# Altium project APE - Single Board Computer.PrjPcb (part 2 of 3)

## Sheet 07_Storage.SchDoc
size 812 x 508 mm; SheetNumber: 7; SheetTotal: 16
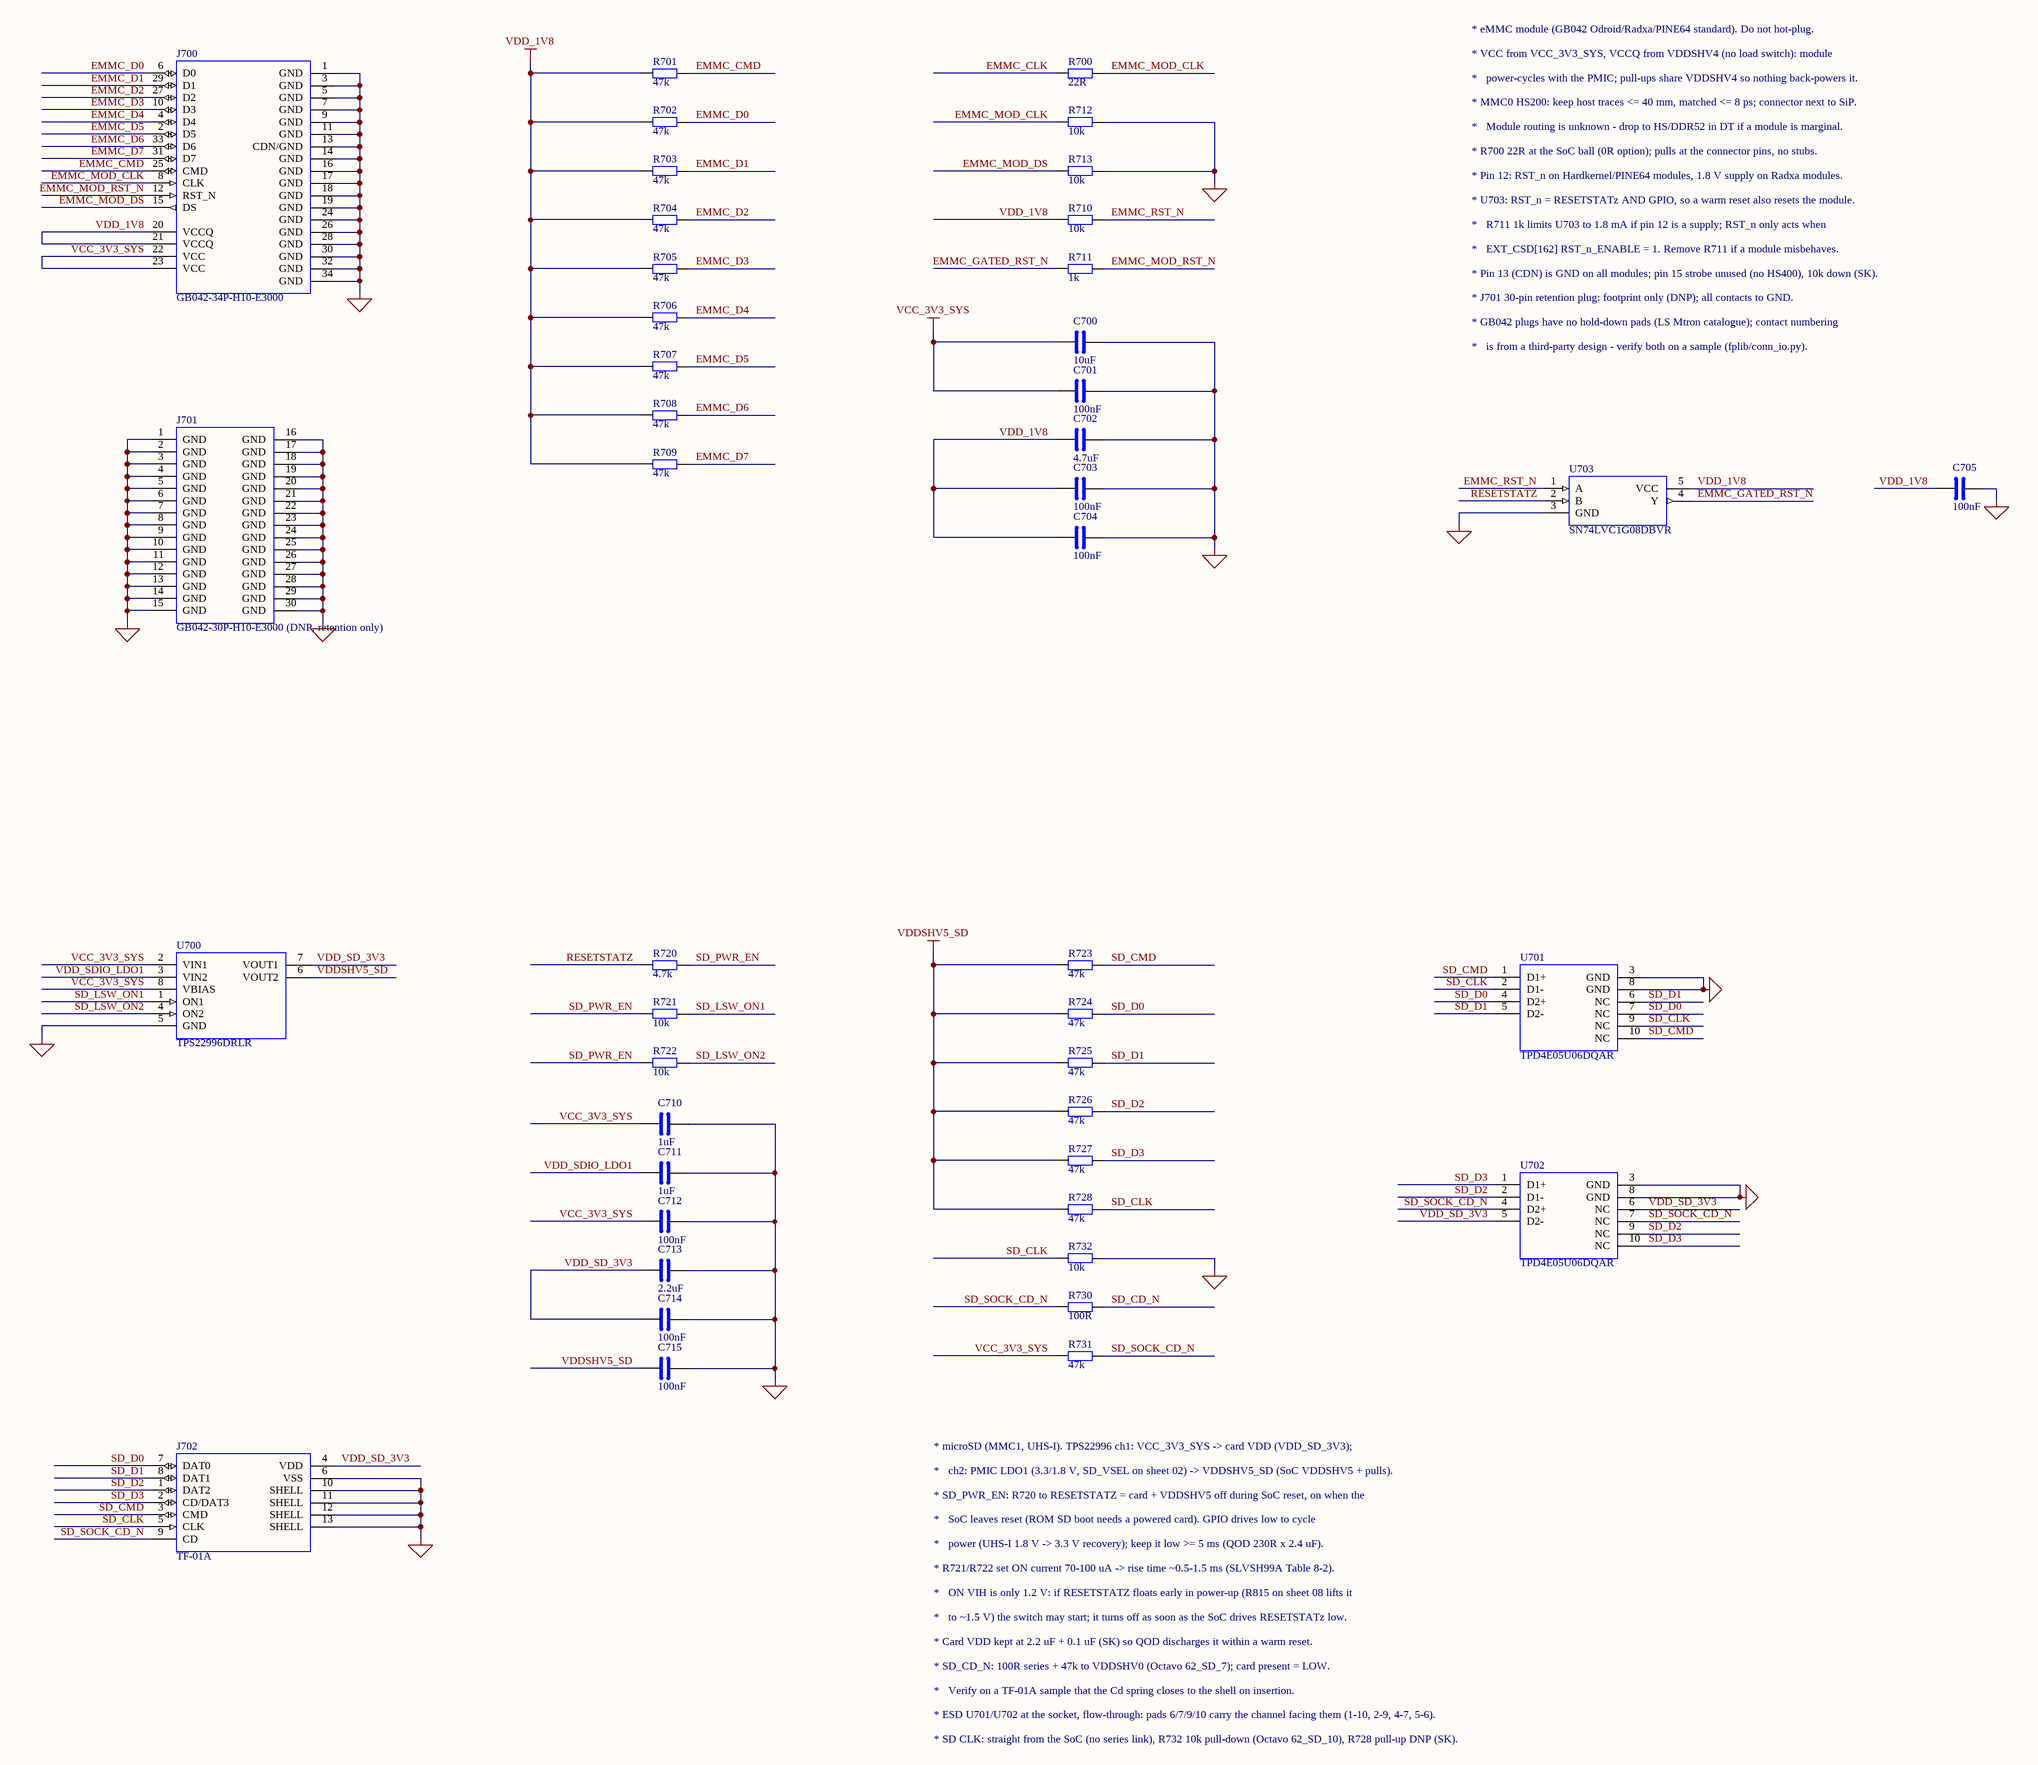
[diagram p9: 07_Storage.SchDoc]

### Parts
C700  10uF  [C0603]
C701  100nF  [C0402]
C702  4.7uF  [C0603]
C703  100nF  [C0402]
C704  100nF  [C0402]
C705  100nF  [C0402]
C710  1uF  [C0402]
C711  1uF  [C0402]
C712  100nF  [C0402]
C713  2.2uF  [C0402]
C714  100nF  [C0402]
C715  100nF  [C0402]
J700  GB042-34P-H10-E3000  [B2B_LSM_GB042-34P-H10]
J701  GB042-30P-H10-E3000 (DNP, retention only)  [B2B_LSM_GB042-30P-H10]
J702  TF-01A  [MICROSD_HRO_TF-01A]
R700  22R  [R0402]
R701  47k  [R0402]
R702  47k  [R0402]
R703  47k  [R0402]
R704  47k  [R0402]
R705  47k  [R0402]
R706  47k  [R0402]
R707  47k  [R0402]
R708  47k  [R0402]
R709  47k  [R0402]
R710  10k  [R0402]
R711  1k  [R0402]
R712  10k  [R0402]
R713  10k  [R0402]
R720  4.7k  [R0402]
R721  10k  [R0402]
R722  10k  [R0402]
R723  47k  [R0402]
R724  47k  [R0402]
R725  47k  [R0402]
R726  47k  [R0402]
R727  47k  [R0402]
R728  47k  [R0402]
R730  100R  [R0402]
R731  47k  [R0402]
R732  10k  [R0402]
U700  TPS22996DRLR  [SOT583-8]
U701  TPD4E05U06DQAR  [USON10_DQA]
U702  TPD4E05U06DQAR  [USON10_DQA]
U703  SN74LVC1G08DBVR  [SOT23-5]

### Nets
GND: C700.2 C701.2 C702.2 C703.2 C704.2 C705.2 C710.2 C711.2 C712.2 C713.2 C714.2 C715.2 J700.1(GND) J700.3(GND) J700.5(GND) J700.7(GND) J700.9(GND) J700.11(GND) J700.13(CDN/GND) J700.14(GND) J700.16(GND) J700.17(GND) J700.18(GND) J700.19(GND) J700.24(GND) J700.26(GND) J700.28(GND) J700.30(GND) J700.32(GND) J700.34(GND) J701.1(GND) J701.2(GND) J701.3(GND) J701.4(GND) J701.5(GND) J701.6(GND) J701.7(GND) J701.8(GND) J701.9(GND) J701.10(GND) J701.11(GND) J701.12(GND) J701.13(GND) J701.14(GND) J701.15(GND) J701.16(GND) J701.17(GND) J701.18(GND) J701.19(GND) J701.20(GND) J701.21(GND) J701.22(GND) J701.23(GND) J701.24(GND) J701.25(GND) J701.26(GND) J701.27(GND) J701.28(GND) J701.29(GND) J701.30(GND) J702.6(VSS) J702.10(SHELL) J702.11(SHELL) J702.12(SHELL) J702.13(SHELL) R712.2 R713.2 R732.2 U700.5(GND) U701.3(GND) U701.8(GND) U702.3(GND) U702.8(GND) U703.3(GND)
VCC_3V3_SYS: C700.1 C701.1 C710.1 C712.1 J700.22(VCC) J700.23(VCC) R731.1 U700.2(VIN1) U700.8(VBIAS)
VDD_1V8: C702.1 C703.1 C704.1 C705.1 J700.20(VCCQ) J700.21(VCCQ) R701.1 R702.1 R703.1 R704.1 R705.1 R706.1 R707.1 R708.1 R709.1 R710.1 U703.5(VCC)
VDDSHV5_SD: C715.1 R723.1 R724.1 R725.1 R726.1 R727.1 R728.1 U700.6(VOUT2)
EMMC_CLK: R700.1
EMMC_CMD: J700.25(CMD) R701.2
EMMC_D0: J700.6(D0) R702.2
EMMC_D1: J700.29(D1) R703.2
EMMC_D2: J700.27(D2) R704.2
EMMC_D3: J700.10(D3) R705.2
EMMC_D4: J700.4(D4) R706.2
EMMC_D5: J700.2(D5) R707.2
EMMC_D6: J700.33(D6) R708.2
EMMC_D7: J700.31(D7) R709.2
EMMC_GATED_RST_N: R711.1 U703.4(Y)
EMMC_MOD_CLK: J700.8(CLK) R700.2 R712.1
EMMC_MOD_DS: J700.15(DS) R713.1
EMMC_MOD_RST_N: J700.12(RST_N) R711.2
EMMC_RST_N: R710.2 U703.1(A)
RESETSTATZ: R720.1 U703.2(B)
SD_CD_N: R730.2
SD_CLK: J702.5(CLK) R728.2 R732.1 U701.2(D1-) U701.9(NC)
SD_CMD: J702.3(CMD) R723.2 U701.1(D1+) U701.10(NC)
SD_D0: J702.7(DAT0) R724.2 U701.4(D2+) U701.7(NC)
SD_D1: J702.8(DAT1) R725.2 U701.5(D2-) U701.6(NC)
SD_D2: J702.1(DAT2) R726.2 U702.2(D1-) U702.9(NC)
SD_D3: J702.2(CD/DAT3) R727.2 U702.1(D1+) U702.10(NC)
SD_LSW_ON1: R721.2 U700.1(ON1)
SD_LSW_ON2: R722.2 U700.4(ON2)
SD_PWR_EN: R720.2 R721.1 R722.1
SD_SOCK_CD_N: J702.9(CD) R730.1 R731.2 U702.4(D2+) U702.7(NC)
VDD_SD_3V3: C713.1 C714.1 J702.4(VDD) U700.7(VOUT1) U702.5(D2-) U702.6(NC)
VDD_SDIO_LDO1: C711.1 U700.3(VIN2)

### Notes on the sheet
- * eMMC module (GB042 Odroid/Radxa/PINE64 standard). Do not hot-plug.
- * VCC from VCC_3V3_SYS, VCCQ from VDDSHV4 (no load switch): module
- *   power-cycles with the PMIC; pull-ups share VDDSHV4 so nothing back-powers it.
- * MMC0 HS200: keep host traces <= 40 mm, matched <= 8 ps; connector next to SiP.
- *   Module routing is unknown - drop to HS/DDR52 in DT if a module is marginal.
- * R700 22R at the SoC ball (0R option); pulls at the connector pins, no stubs.
- * Pin 12: RST_n on Hardkernel/PINE64 modules, 1.8 V supply on Radxa modules.
- * U703: RST_n = RESETSTATz AND GPIO, so a warm reset also resets the module.
- *   R711 1k limits U703 to 1.8 mA if pin 12 is a supply; RST_n only acts when
- *   EXT_CSD[162] RST_n_ENABLE = 1. Remove R711 if a module misbehaves.
- * Pin 13 (CDN) is GND on all modules; pin 15 strobe unused (no HS400), 10k down (SK).
- * J701 30-pin retention plug: footprint only (DNP); all contacts to GND.
- * GB042 plugs have no hold-down pads (LS Mtron catalogue); contact numbering
- *   is from a third-party design - verify both on a sample (fplib/conn_io.py).
- * microSD (MMC1, UHS-I). TPS22996 ch1: VCC_3V3_SYS -> card VDD (VDD_SD_3V3);
- *   ch2: PMIC LDO1 (3.3/1.8 V, SD_VSEL on sheet 02) -> VDDSHV5_SD (SoC VDDSHV5 + pulls).
- * SD_PWR_EN: R720 to RESETSTATZ = card + VDDSHV5 off during SoC reset, on when the
- *   SoC leaves reset (ROM SD boot needs a powered card). GPIO drives low to cycle
- *   power (UHS-I 1.8 V -> 3.3 V recovery); keep it low >= 5 ms (QOD 230R x 2.4 uF).
- * R721/R722 set ON current 70-100 uA -> rise time ~0.5-1.5 ms (SLVSH99A Table 8-2).
- *   ON VIH is only 1.2 V: if RESETSTATZ floats early in power-up (R815 on sheet 08 lifts it
- *   to ~1.5 V) the switch may start; it turns off as soon as the SoC drives RESETSTATz low.
- * Card VDD kept at 2.2 uF + 0.1 uF (SK) so QOD discharges it within a warm reset.
- * SD_CD_N: 100R series + 47k to VDDSHV0 (Octavo 62_SD_7); card present = LOW.
- *   Verify on a TF-01A sample that the Cd spring closes to the shell on insertion.
- * ESD U701/U702 at the socket, flow-through: pads 6/7/9/10 carry the channel facing them (1-10, 2-9, 4-7, 5-6).
- * SD CLK: straight from the SoC (no series link), R732 10k pull-down (Octavo 62_SD_10), R728 pull-up DNP (SK).

### Library data of the parts
C700 = CAP: Capacitor, non-polarized; Spec: 10uF 10V X5R 0603 (VCC)
C701 = CAP: Capacitor, non-polarized; Spec: 100nF 16V X7R 0402 (VCC)
C702 = CAP: Capacitor, non-polarized; Spec: 4.7uF 10V X5R 0603 (VCCQ)
C703 = CAP: Capacitor, non-polarized; Spec: 100nF 16V X7R 0402 (VCCQ pin 20)
C704 = CAP: Capacitor, non-polarized; Spec: 100nF 16V X7R 0402 (VCCQ pin 21)
C705 = CAP: Capacitor, non-polarized; Spec: 100nF 16V X7R 0402 (U703 VCC)
C710 = CAP: Capacitor, non-polarized; Spec: 1uF 25V X5R 0402 (VIN1)
C711 = CAP: Capacitor, non-polarized; Spec: 1uF 25V X5R 0402 (VIN2)
C712 = CAP: Capacitor, non-polarized; Spec: 100nF 16V X7R 0402 (VBIAS)
C713 = CAP: Capacitor, non-polarized; Spec: 2.2uF 10V X5R 0402 (card VDD)
C714 = CAP: Capacitor, non-polarized; Spec: 100nF 16V X7R 0402 (card VDD)
C715 = CAP: Capacitor, non-polarized; Spec: 100nF 16V X7R 0402 (VOUT2)
J700 = GB042-34P-H10: eMMC-module connector, LS Mtron GB042 34-pin 0.4 mm B2B plug (Odroid/Radxa/PINE64 pinout); MPN: GB042-34P-H10-E3000; Manufacturer: LS Mtron; Supplier: broker, consigned to JLC (STOCK RISK)
J701 = GB042-30P-H10: eMMC-module retention connector, LS Mtron GB042 30-pin 0.4 mm B2B plug (mechanical, all GND); DNP: 1; MPN: GB042-30P-H10-E3000; Manufacturer: LS Mtron
J702 = TF-01A: microSD push-push socket with card-detect switch (Hroparts TF-01A); Manufacturer: Korean Hroparts Elec; MPN: TF-01A; LCSC: C91145
R700 = RES: Resistor; Spec: 22R 0402 (at SoC; 0R option)
R701-R709 R723-R727 = RES: Resistor; Spec: 47k 0402
R710 = RES: Resistor; Spec: 10k 0402 (GPIO pull-up: reset follows RESETSTATz by default)
R711 = RES: Resistor; Spec: 1k 0402 (RST_n link, see note)
R712 = RES: Resistor; Spec: 10k 0402 (CLK pull-down, at pin 8)
R713 = RES: Resistor; Spec: 10k 0402 (strobe pull-down)
R720 = RES: Resistor; Spec: 4.7k 0402 (SD power follows RESETSTATz)
R721 = RES: Resistor; Spec: 10k 0402 (RT1 rise time)
R722 = RES: Resistor; Spec: 10k 0402 (RT2 rise time)
R728 = RES: Resistor; DNP: 1; Spec: 47k 0402 (DNP)
R730 = RES: Resistor; Spec: 100R 0402 (SDCD series)
R731 = RES: Resistor; Spec: 47k 0402 (SDCD pull-up)
R732 = RES: Resistor; Spec: 10k 0402 (CLK pull-down, Octavo 62_SD_10)
U700 = TPS22996_DRL: TPS22996 dual 4 A load switch with QOD and ON-current set rise time, SOT-583-8; Manufacturer: Texas Instruments; MPN: TPS22996DRLR
U701 U702 = TPD4E05U06_DQA: 4-channel 0.5 pF ESD array, USON-10; Manufacturer: Texas Instruments; MPN: TPD4E05U06DQAR
U703 = SN74LVC1G08_DBV: Single 2-input AND gate, SOT-23-5; Manufacturer: Texas Instruments; MPN: SN74LVC1G08DBVR; LCSC: C7666

## Sheet 08_Ethernet.SchDoc
size 812 x 508 mm; SheetNumber: 8; SheetTotal: 16
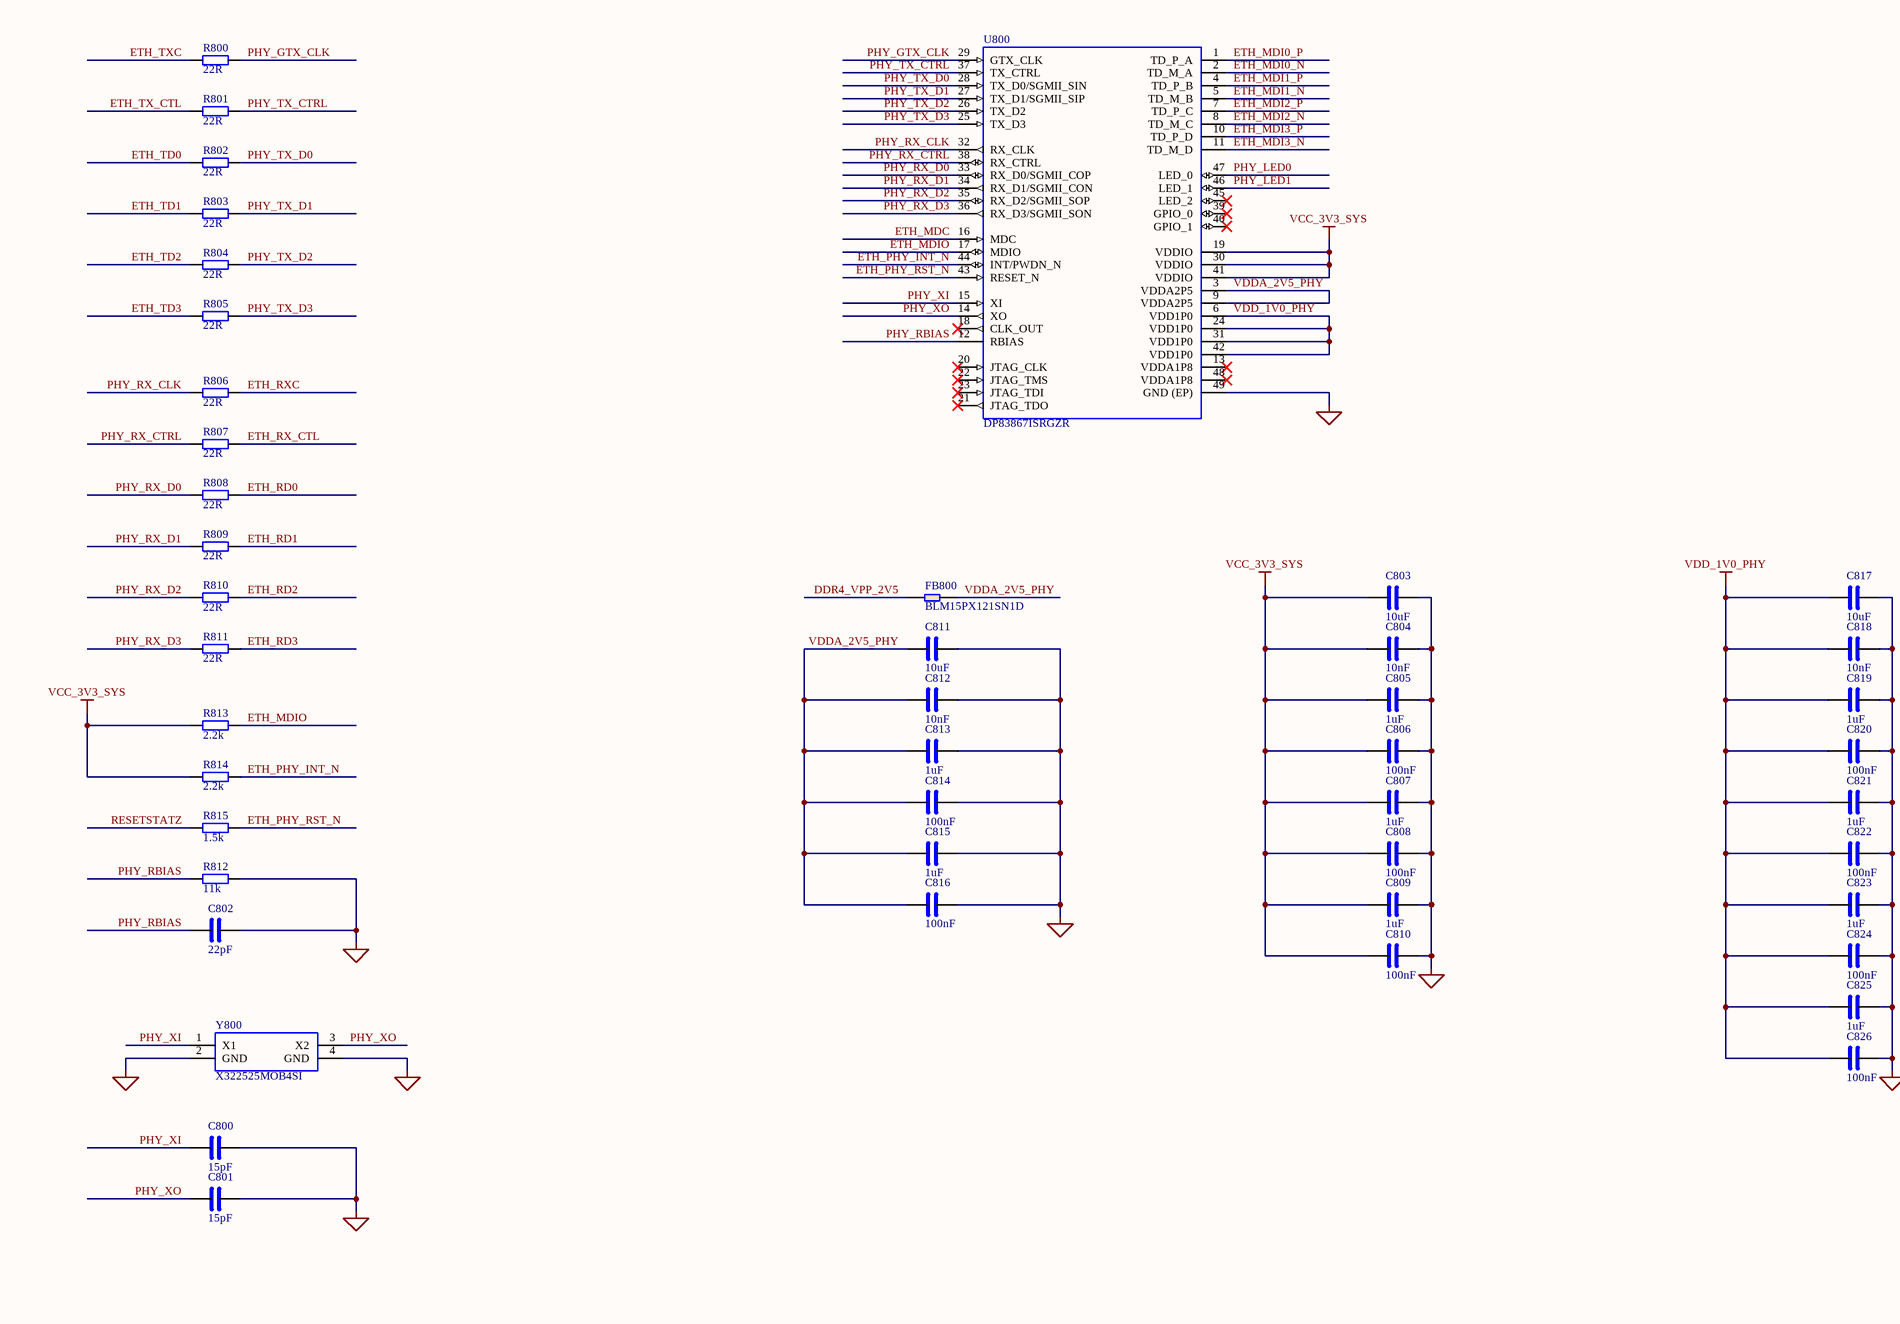
[diagram p10: 08_Ethernet.SchDoc, left]
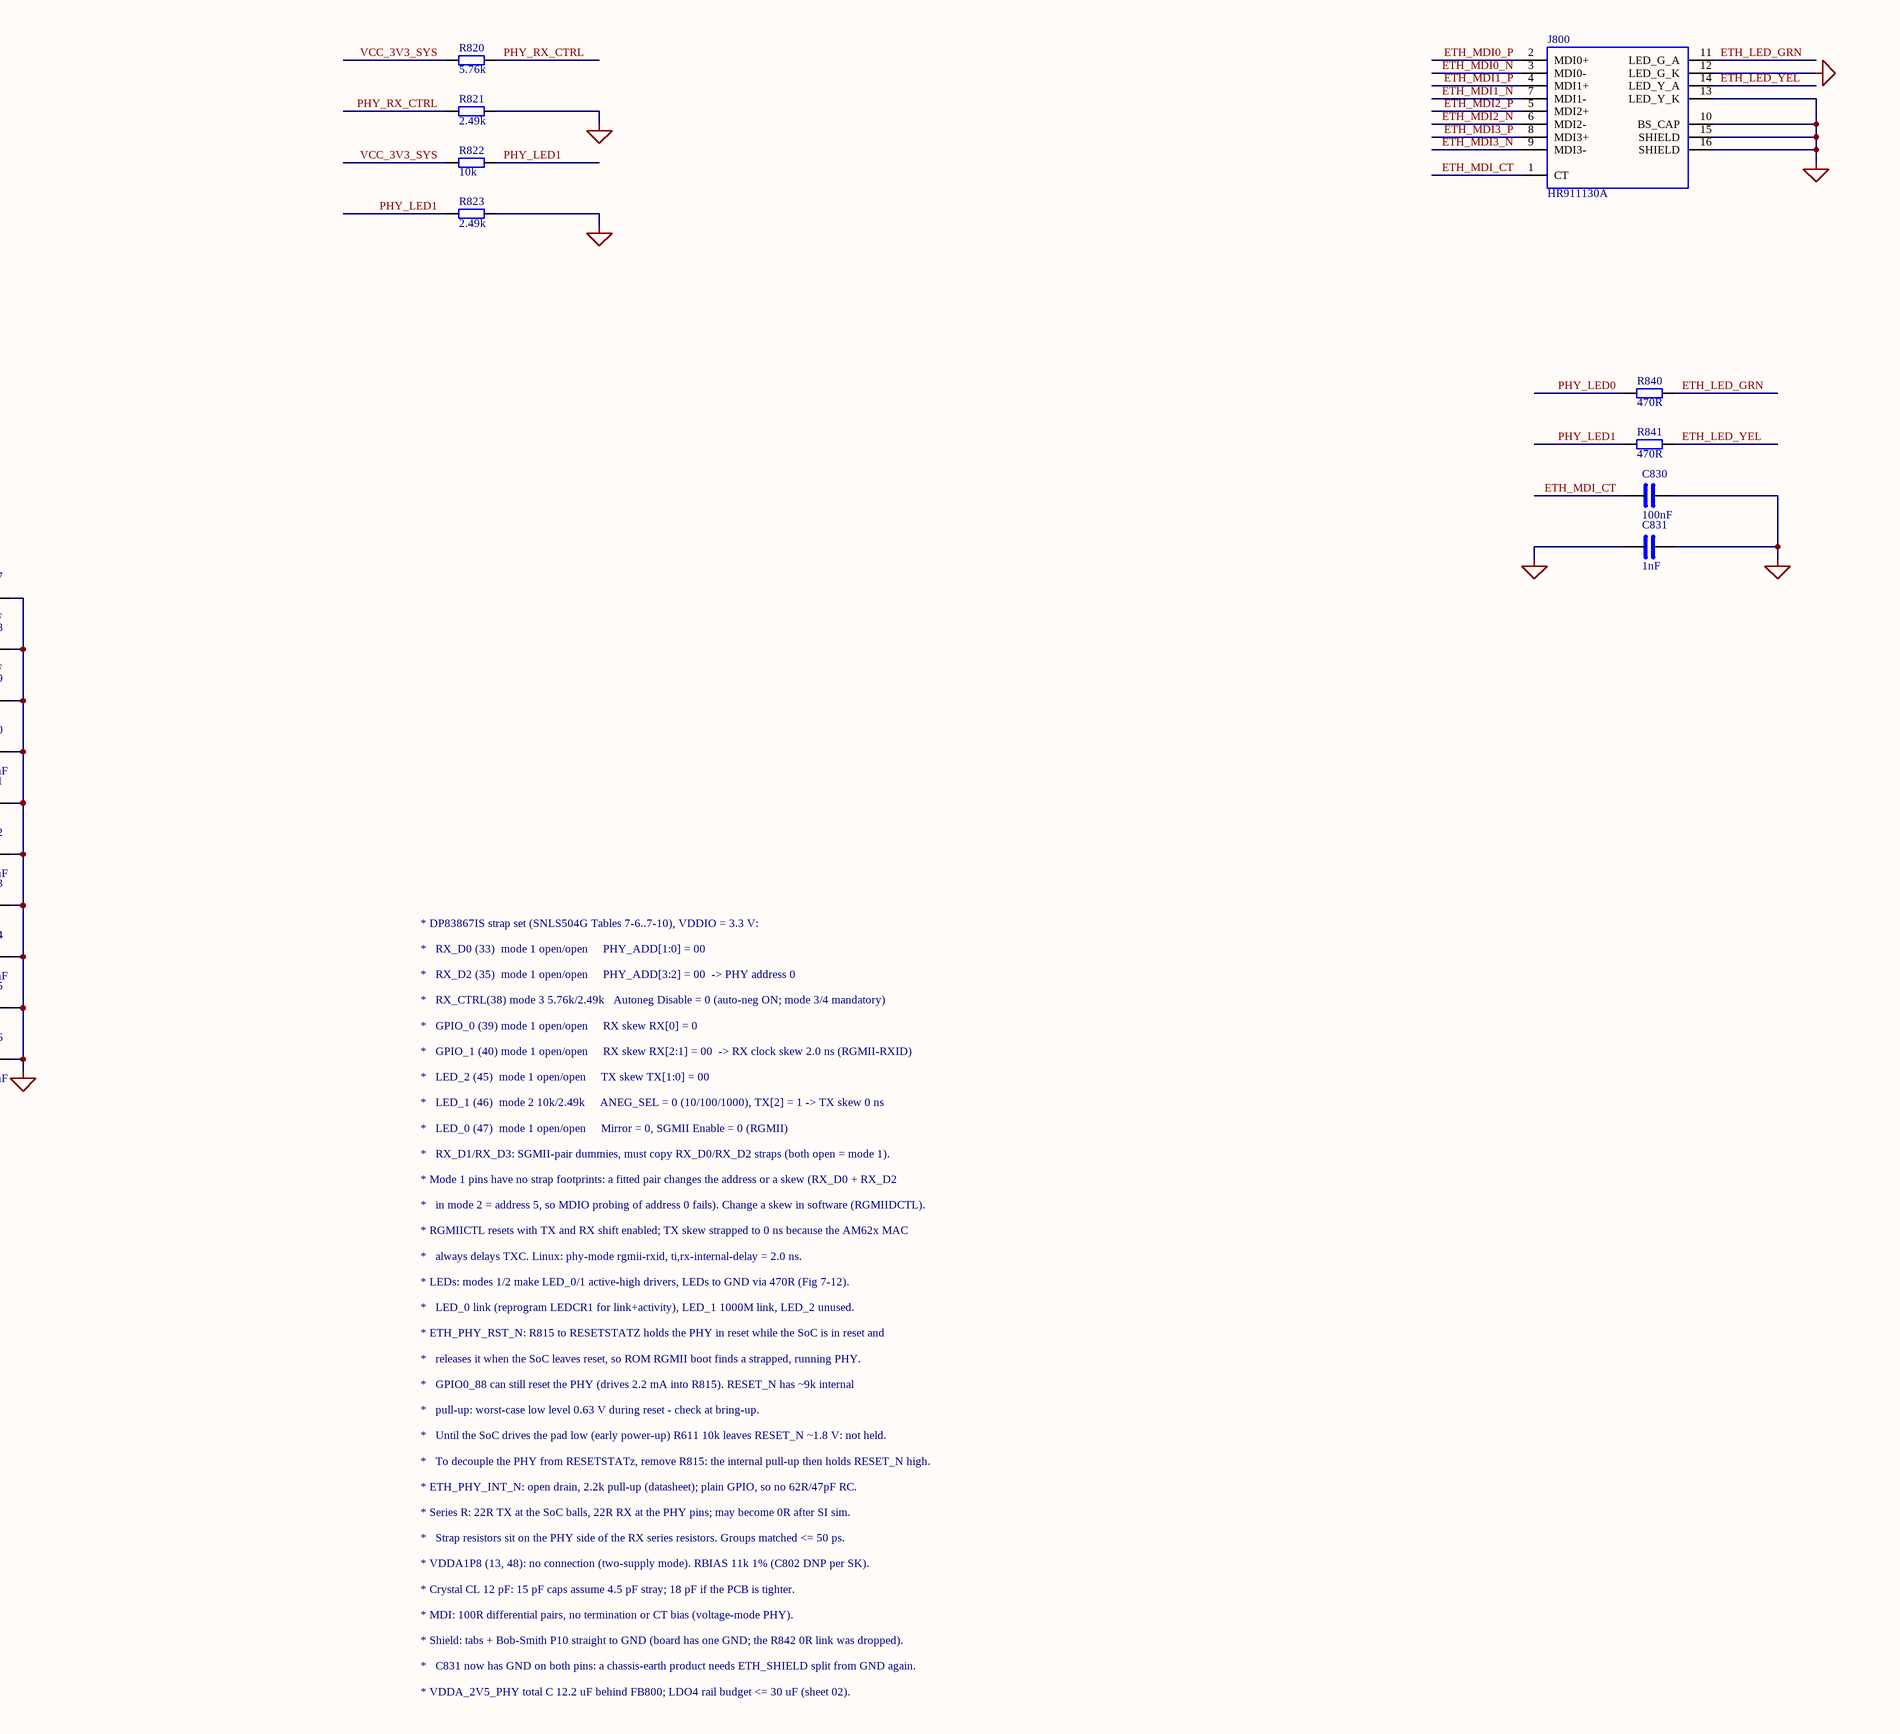
[diagram p11: 08_Ethernet.SchDoc, right]

### Parts
C800  15pF  [C0402]
C801  15pF  [C0402]
C802  22pF  [C0402]
C803  10uF  [C0603]
C804  10nF  [C0402]
C805  1uF  [C0402]
C806  100nF  [C0402]
C807  1uF  [C0402]
C808  100nF  [C0402]
C809  1uF  [C0402]
C810  100nF  [C0402]
C811  10uF  [C0603]
C812  10nF  [C0402]
C813  1uF  [C0402]
C814  100nF  [C0402]
C815  1uF  [C0402]
C816  100nF  [C0402]
C817  10uF  [C0603]
C818  10nF  [C0402]
C819  1uF  [C0402]
C820  100nF  [C0402]
C821  1uF  [C0402]
C822  100nF  [C0402]
C823  1uF  [C0402]
C824  100nF  [C0402]
C825  1uF  [C0402]
C826  100nF  [C0402]
C830  100nF  [C0402]
C831  1nF  [C1206]
FB800  BLM15PX121SN1D  [FB0402]
J800  HR911130A  [RJ45_HANRUN_HR911130A]
R800  22R  [R0402]
R801  22R  [R0402]
R802  22R  [R0402]
R803  22R  [R0402]
R804  22R  [R0402]
R805  22R  [R0402]
R806  22R  [R0402]
R807  22R  [R0402]
R808  22R  [R0402]
R809  22R  [R0402]
R810  22R  [R0402]
R811  22R  [R0402]
R812  11k  [R0402]
R813  2.2k  [R0402]
R814  2.2k  [R0402]
R815  1.5k  [R0402]
R820  5.76k  [R0402]
R821  2.49k  [R0402]
R822  10k  [R0402]
R823  2.49k  [R0402]
R840  470R  [R0402]
R841  470R  [R0402]
U800  DP83867ISRGZR  [VQFN48_RGZ_7X7]
Y800  X322525MOB4SI  [XTAL_3225_4P]

### Nets
GND: C800.2 C801.2 C802.2 C803.2 C804.2 C805.2 C806.2 C807.2 C808.2 C809.2 C810.2 C811.2 C812.2 C813.2 C814.2 C815.2 C816.2 C817.2 C818.2 C819.2 C820.2 C821.2 C822.2 C823.2 C824.2 C825.2 C826.2 C830.2 C831.1 C831.2 J800.10(BS_CAP) J800.12(LED_G_K) J800.13(LED_Y_K) J800.15(SHIELD) J800.16(SHIELD) R812.2 R821.2 R823.2 U800.49(GND_(EP)) Y800.2(GND) Y800.4(GND)
VCC_3V3_SYS: C803.1 C804.1 C805.1 C806.1 C807.1 C808.1 C809.1 C810.1 R813.1 R814.1 R820.1 R822.1 U800.19(VDDIO) U800.30(VDDIO) U800.41(VDDIO)
VDD_1V0_PHY: C817.1 C818.1 C819.1 C820.1 C821.1 C822.1 C823.1 C824.1 C825.1 C826.1 U800.6(VDD1P0) U800.24(VDD1P0) U800.31(VDD1P0) U800.42(VDD1P0)
DDR4_VPP_2V5: FB800.1
ETH_LED_GRN: J800.11(LED_G_A) R840.2
ETH_LED_YEL: J800.14(LED_Y_A) R841.2
ETH_MDC: U800.16(MDC)
ETH_MDI0_N: J800.3(MDI0-) U800.2(TD_M_A)
ETH_MDI0_P: J800.2(MDI0+) U800.1(TD_P_A)
ETH_MDI1_N: J800.7(MDI1-) U800.5(TD_M_B)
ETH_MDI1_P: J800.4(MDI1+) U800.4(TD_P_B)
ETH_MDI2_N: J800.6(MDI2-) U800.8(TD_M_C)
ETH_MDI2_P: J800.5(MDI2+) U800.7(TD_P_C)
ETH_MDI3_N: J800.9(MDI3-) U800.11(TD_M_D)
ETH_MDI3_P: J800.8(MDI3+) U800.10(TD_P_D)
ETH_MDI_CT: C830.1 J800.1(CT)
ETH_MDIO: R813.2 U800.17(MDIO)
ETH_PHY_INT_N: R814.2 U800.44(INT/PWDN_N)
ETH_PHY_RST_N: R815.2 U800.43(RESET_N)
ETH_RD0: R808.2
ETH_RD1: R809.2
ETH_RD2: R810.2
ETH_RD3: R811.2
ETH_RX_CTL: R807.2
ETH_RXC: R806.2
ETH_TD0: R802.1
ETH_TD1: R803.1
ETH_TD2: R804.1
ETH_TD3: R805.1
ETH_TX_CTL: R801.1
ETH_TXC: R800.1
PHY_GTX_CLK: R800.2 U800.29(GTX_CLK)
PHY_LED0: R840.1 U800.47(LED_0)
PHY_LED1: R822.2 R823.1 R841.1 U800.46(LED_1)
PHY_RBIAS: C802.1 R812.1 U800.12(RBIAS)
PHY_RX_CLK: R806.1 U800.32(RX_CLK)
PHY_RX_CTRL: R807.1 R820.2 R821.1 U800.38(RX_CTRL)
PHY_RX_D0: R808.1 U800.33(RX_D0/SGMII_COP)
PHY_RX_D1: R809.1 U800.34(RX_D1/SGMII_CON)
PHY_RX_D2: R810.1 U800.35(RX_D2/SGMII_SOP)
PHY_RX_D3: R811.1 U800.36(RX_D3/SGMII_SON)
PHY_TX_CTRL: R801.2 U800.37(TX_CTRL)
PHY_TX_D0: R802.2 U800.28(TX_D0/SGMII_SIN)
PHY_TX_D1: R803.2 U800.27(TX_D1/SGMII_SIP)
PHY_TX_D2: R804.2 U800.26(TX_D2)
PHY_TX_D3: R805.2 U800.25(TX_D3)
PHY_XI: C800.1 U800.15(XI) Y800.1(X1)
PHY_XO: C801.1 U800.14(XO) Y800.3(X2)
RESETSTATZ: R815.1
VDDA_2V5_PHY: C811.1 C812.1 C813.1 C814.1 C815.1 C816.1 FB800.2 U800.3(VDDA2P5) U800.9(VDDA2P5)

Not connected (* = marked no-connect by the designer): U800 13(VDDA1P8)* 18(CLK_OUT)* 20(JTAG_CLK)* 21(JTAG_TDO)* 22(JTAG_TMS)* 23(JTAG_TDI)* 39(GPIO_0)* 40(GPIO_1)* 45(LED_2)* 48(VDDA1P8)*

### Notes on the sheet
- * DP83867IS strap set (SNLS504G Tables 7-6..7-10), VDDIO = 3.3 V:
- *   RX_D0 (33)  mode 1 open/open     PHY_ADD[1:0] = 00
- *   RX_D2 (35)  mode 1 open/open     PHY_ADD[3:2] = 00  -> PHY address 0
- *   RX_CTRL(38) mode 3 5.76k/2.49k   Autoneg Disable = 0 (auto-neg ON; mode 3/4 mandatory)
- *   GPIO_0 (39) mode 1 open/open     RX skew RX[0] = 0
- *   GPIO_1 (40) mode 1 open/open     RX skew RX[2:1] = 00  -> RX clock skew 2.0 ns (RGMII-RXID)
- *   LED_2 (45)  mode 1 open/open     TX skew TX[1:0] = 00
- *   LED_1 (46)  mode 2 10k/2.49k     ANEG_SEL = 0 (10/100/1000), TX[2] = 1 -> TX skew 0 ns
- *   LED_0 (47)  mode 1 open/open     Mirror = 0, SGMII Enable = 0 (RGMII)
- *   RX_D1/RX_D3: SGMII-pair dummies, must copy RX_D0/RX_D2 straps (both open = mode 1).
- * Mode 1 pins have no strap footprints: a fitted pair changes the address or a skew (RX_D0 + RX_D2
- *   in mode 2 = address 5, so MDIO probing of address 0 fails). Change a skew in software (RGMIIDCTL).
- * RGMIICTL resets with TX and RX shift enabled; TX skew strapped to 0 ns because the AM62x MAC
- *   always delays TXC. Linux: phy-mode rgmii-rxid, ti,rx-internal-delay = 2.0 ns.
- * LEDs: modes 1/2 make LED_0/1 active-high drivers, LEDs to GND via 470R (Fig 7-12).
- *   LED_0 link (reprogram LEDCR1 for link+activity), LED_1 1000M link, LED_2 unused.
- * ETH_PHY_RST_N: R815 to RESETSTATZ holds the PHY in reset while the SoC is in reset and
- *   releases it when the SoC leaves reset, so ROM RGMII boot finds a strapped, running PHY.
- *   GPIO0_88 can still reset the PHY (drives 2.2 mA into R815). RESET_N has ~9k internal
- *   pull-up: worst-case low level 0.63 V during reset - check at bring-up.
- *   Until the SoC drives the pad low (early power-up) R611 10k leaves RESET_N ~1.8 V: not held.
- *   To decouple the PHY from RESETSTATz, remove R815: the internal pull-up then holds RESET_N high.
- * ETH_PHY_INT_N: open drain, 2.2k pull-up (datasheet); plain GPIO, so no 62R/47pF RC.
- * Series R: 22R TX at the SoC balls, 22R RX at the PHY pins; may become 0R after SI sim.
- *   Strap resistors sit on the PHY side of the RX series resistors. Groups matched <= 50 ps.
- * VDDA1P8 (13, 48): no connection (two-supply mode). RBIAS 11k 1% (C802 DNP per SK).
- * Crystal CL 12 pF: 15 pF caps assume 4.5 pF stray; 18 pF if the PCB is tighter.
- * MDI: 100R differential pairs, no termination or CT bias (voltage-mode PHY).
- * Shield: tabs + Bob-Smith P10 straight to GND (board has one GND; the R842 0R link was dropped).
- *   C831 now has GND on both pins: a chassis-earth product needs ETH_SHIELD split from GND again.
- * VDDA_2V5_PHY total C 12.2 uF behind FB800; LDO4 rail budget <= 30 uF (sheet 02).

### Library data of the parts
C800 C801 = CAP: Capacitor, non-polarized; Spec: 15pF 50V C0G 0402
C802 = CAP: Capacitor, non-polarized; DNP: 1; Spec: 22pF 50V C0G 0402 (DNP, SK compliance option)
C803 = CAP: Capacitor, non-polarized; Spec: 10uF 10V X5R 0603 (VDDIO bulk)
C804 = CAP: Capacitor, non-polarized; Spec: 10nF 25V X7R 0402 (VDDIO bulk)
C805 = CAP: Capacitor, non-polarized; Spec: 1uF 25V X5R 0402 (pin 19)
C806 = CAP: Capacitor, non-polarized; Spec: 100nF 16V X7R 0402 (pin 19)
C807 = CAP: Capacitor, non-polarized; Spec: 1uF 25V X5R 0402 (pin 30)
C808 = CAP: Capacitor, non-polarized; Spec: 100nF 16V X7R 0402 (pin 30)
C809 = CAP: Capacitor, non-polarized; Spec: 1uF 25V X5R 0402 (pin 41)
C810 = CAP: Capacitor, non-polarized; Spec: 100nF 16V X7R 0402 (pin 41)
C811 = CAP: Capacitor, non-polarized; Spec: 10uF 10V X5R 0603 (VDDA2P5 bulk)
C812 = CAP: Capacitor, non-polarized; Spec: 10nF 25V X7R 0402 (VDDA2P5 bulk)
C813 = CAP: Capacitor, non-polarized; Spec: 1uF 25V X5R 0402 (pin 3)
C814 = CAP: Capacitor, non-polarized; Spec: 100nF 16V X7R 0402 (pin 3)
C815 = CAP: Capacitor, non-polarized; Spec: 1uF 25V X5R 0402 (pin 9)
C816 = CAP: Capacitor, non-polarized; Spec: 100nF 16V X7R 0402 (pin 9)
C817 = CAP: Capacitor, non-polarized; Spec: 10uF 10V X5R 0603 (VDD1P0 bulk)
C818 = CAP: Capacitor, non-polarized; Spec: 10nF 25V X7R 0402 (VDD1P0 bulk)
C819 = CAP: Capacitor, non-polarized; Spec: 1uF 25V X5R 0402 (pin 6)
C820 = CAP: Capacitor, non-polarized; Spec: 100nF 16V X7R 0402 (pin 6)
C821 = CAP: Capacitor, non-polarized; Spec: 1uF 25V X5R 0402 (pin 24)
C822 = CAP: Capacitor, non-polarized; Spec: 100nF 16V X7R 0402 (pin 24)
C823 = CAP: Capacitor, non-polarized; Spec: 1uF 25V X5R 0402 (pin 31)
C824 = CAP: Capacitor, non-polarized; Spec: 100nF 16V X7R 0402 (pin 31)
C825 = CAP: Capacitor, non-polarized; Spec: 1uF 25V X5R 0402 (pin 42)
C826 = CAP: Capacitor, non-polarized; Spec: 100nF 16V X7R 0402 (pin 42)
C830 = CAP: Capacitor, non-polarized; Spec: 100nF 16V X7R 0402 (centre tap)
C831 = CAP: Capacitor, non-polarized; DNP: 1; Spec: 1nF 2kV X7R 1206 (DNP, AC-coupled shield option)
FB800 = FERRITE: Ferrite bead; Manufacturer: Murata; Spec: BLM15PX121SN1D 120R@100MHz 2A; MPN: BLM15PX121SN1D
J800 = HR911130A: RJ45 MagJack, 1000BASE-T 1CT:1CT magnetics, green/yellow LEDs, shielded (HanRun HR911130A); MPN: HR911130A; Manufacturer: HanRun; LCSC: C54408
R800-R805 = RES: Resistor; Spec: 22R 0402 (at SoC)
R806-R811 = RES: Resistor; Spec: 22R 0402 (at PHY)
R812 = RES: Resistor; Spec: 11k 1% 0402 (RBIAS)
R813 = RES: Resistor; Spec: 2.2k 0402 (MDIO pull-up)
R814 = RES: Resistor; Spec: 2.2k 0402 (INT open drain)
R815 = RES: Resistor; Spec: 1.5k 0402 (reset follows RESETSTATz)
R820 = RES: Resistor; Spec: 5.76k 1% 0402 (Rhi RX_CTRL mode 3)
R821 = RES: Resistor; Spec: 2.49k 1% 0402 (Rlo RX_CTRL mode 3)
R822 = RES: Resistor; Spec: 10k 1% 0402 (Rhi LED_1 mode 2)
R823 = RES: Resistor; Spec: 2.49k 1% 0402 (Rlo LED_1 mode 2)
R840 = RES: Resistor; Spec: 470R 0402 (green = LED_0 link)
R841 = RES: Resistor; Spec: 470R 0402 (yellow = LED_1 1000M)
U800 = DP83867_RGZ: DP83867IS/E/CS 10/100/1000 Ethernet PHY, RGMII/SGMII, VQFN-48 RGZ; Manufacturer: Texas Instruments; MPN: DP83867ISRGZR; LCSC: C543036
Y800 = XTAL4_3225: Crystal, 3.2x2.5 mm, 4 pads (1/3 crystal, 2/4 case GND); Manufacturer: YXC; Spec: X322525MOB4SI 25MHz 12pF 10ppm; MPN: X322525MOB4SI; LCSC: C9006

## Sheet 09_USB.SchDoc
size 812 x 508 mm; SheetNumber: 9; SheetTotal: 16
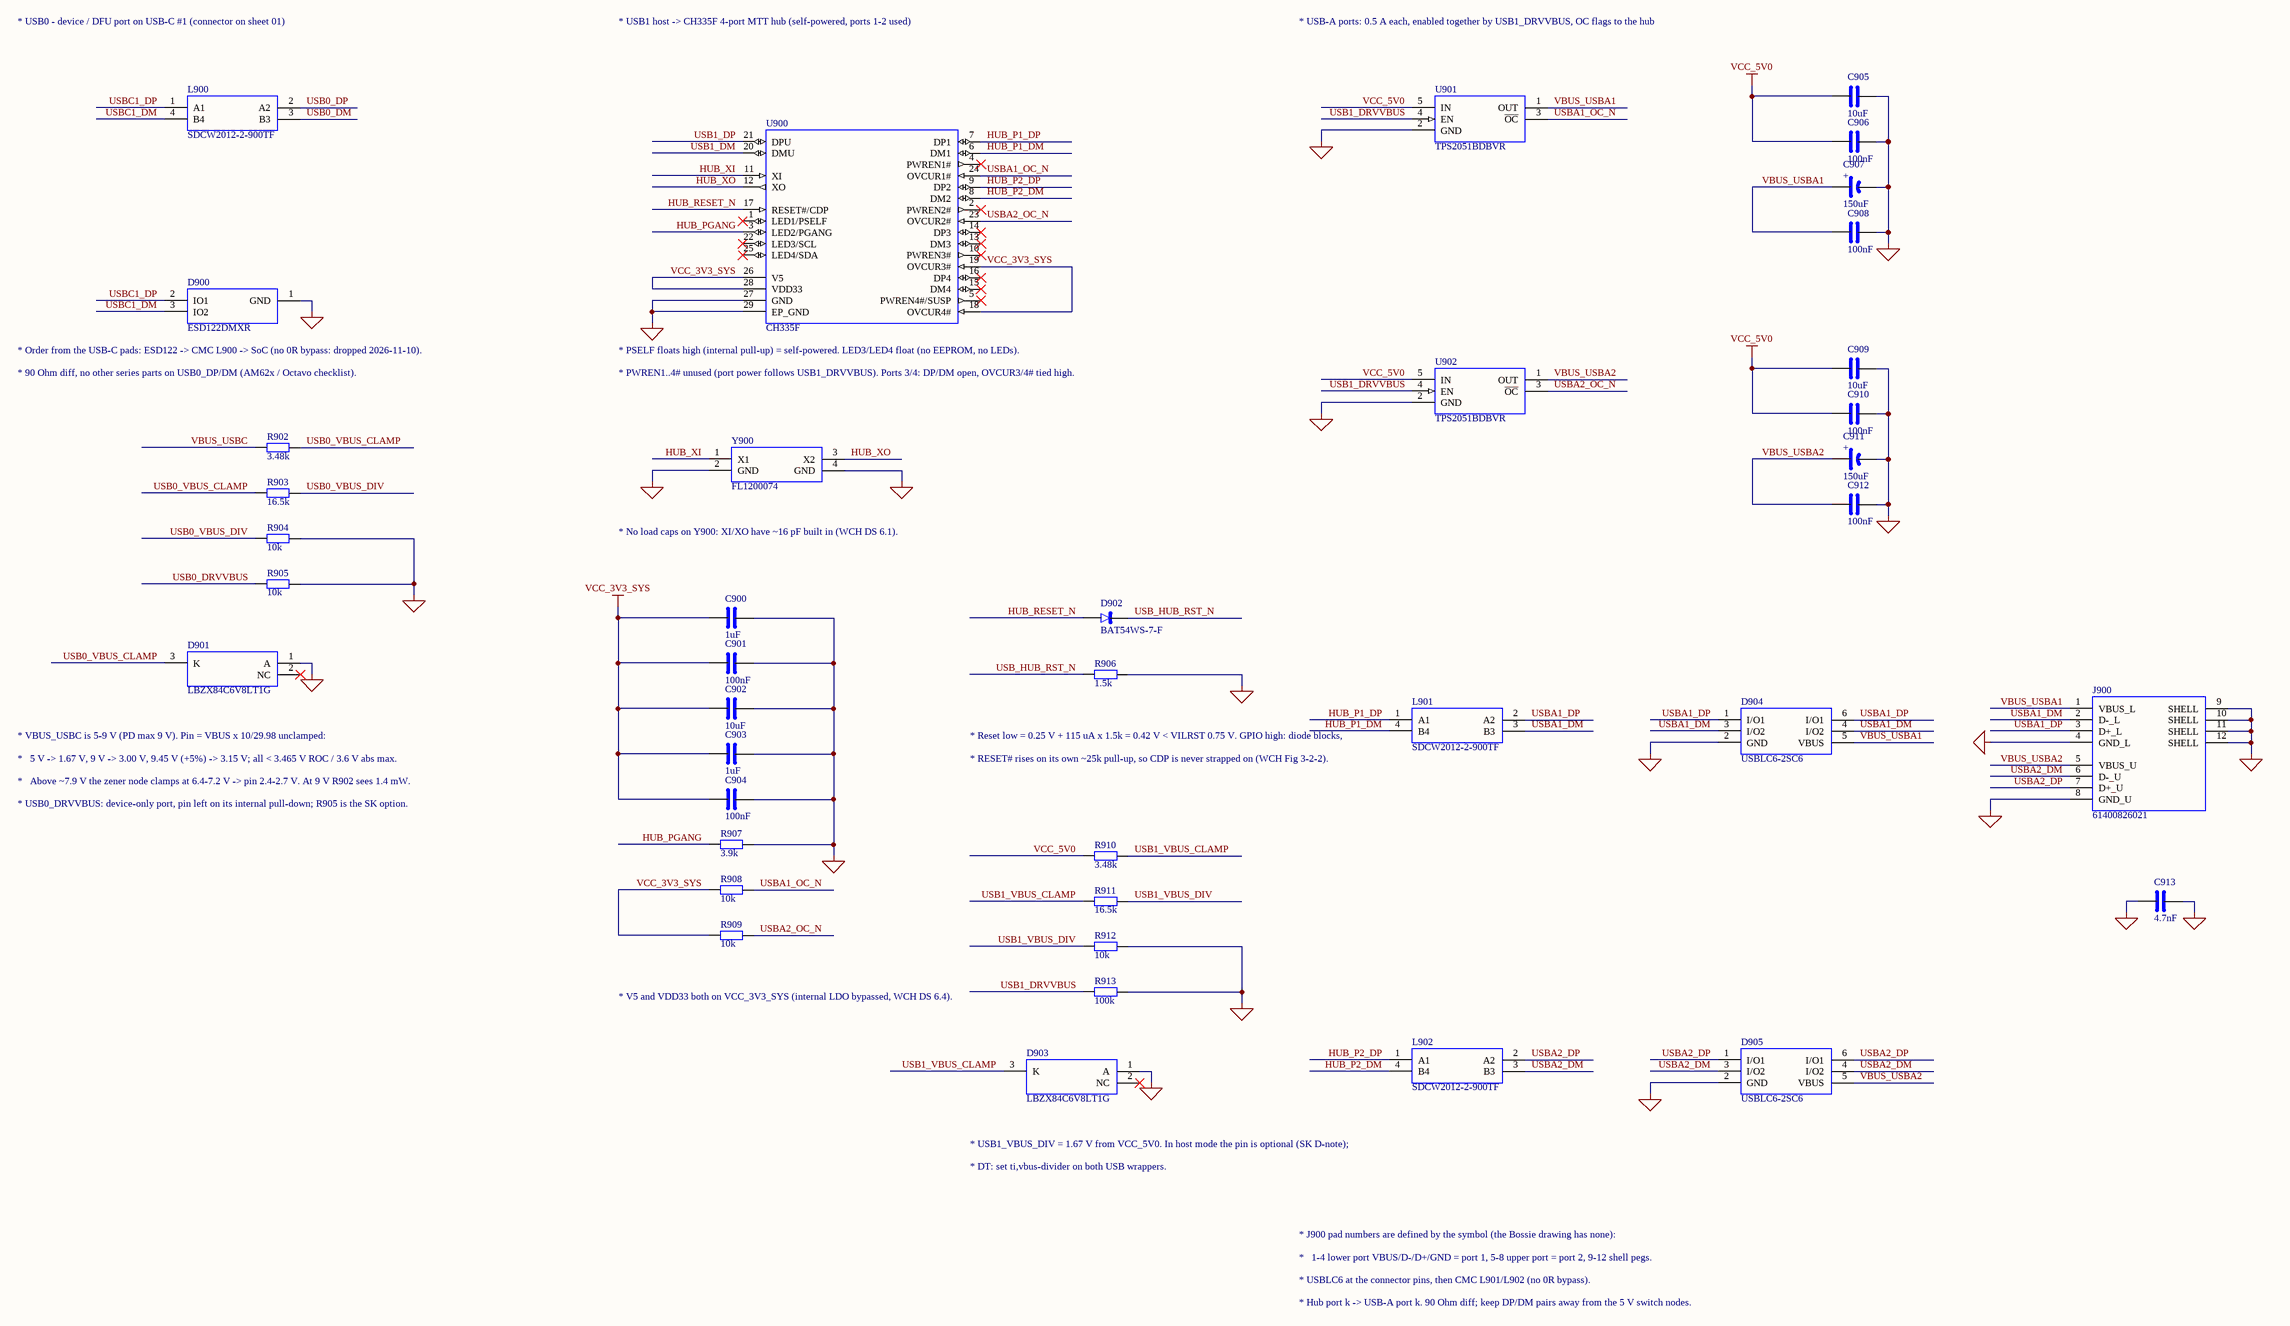
[diagram p12: 09_USB.SchDoc]

### Parts
C900  1uF  [C0402]
C901  100nF  [C0402]
C902  10uF  [C0603]
C903  1uF  [C0402]
C904  100nF  [C0402]
C905  10uF  [C0805]
C906  100nF  [C0402]
C907  150uF  [CP_SMD_D6.3X5.8]
C908  100nF  [C0402]
C909  10uF  [C0805]
C910  100nF  [C0402]
C911  150uF  [CP_SMD_D6.3X5.8]
C912  100nF  [C0402]
C913  4.7nF  [C1206]
D900  ESD122DMXR  [X2SON3_DMX]
D901  LBZX84C6V8LT1G  [SOT23-3]
D902  BAT54WS-7-F  [SOD323]
D903  LBZX84C6V8LT1G  [SOT23-3]
D904  USBLC6-2SC6  [SOT23-6]
D905  USBLC6-2SC6  [SOT23-6]
J900  61400826021  [USBA_2X_BX-TYPE-A-MWC44]
L900  SDCW2012-2-900TF  [CMC_SUNLORD_SDCW2012]
L901  SDCW2012-2-900TF  [CMC_SUNLORD_SDCW2012]
L902  SDCW2012-2-900TF  [CMC_SUNLORD_SDCW2012]
R902  3.48k  [R0402]
R903  16.5k  [R0402]
R904  10k  [R0402]
R905  10k  [R0402]
R906  1.5k  [R0402]
R907  3.9k  [R0402]
R908  10k  [R0402]
R909  10k  [R0402]
R910  3.48k  [R0402]
R911  16.5k  [R0402]
R912  10k  [R0402]
R913  100k  [R0402]
U900  CH335F  [QFN28_4X4_P0.4]
U901  TPS2051BDBVR  [SOT23-5]
U902  TPS2051BDBVR  [SOT23-5]
Y900  FL1200074  [XTAL_3225_4P]

### Nets
GND: C900.2 C901.2 C902.2 C903.2 C904.2 C905.2 C906.2 C907.2 C908.2 C909.2 C910.2 C911.2 C912.2 C913.1 C913.2 D900.1(GND) D901.1(A) D903.1(A) D904.2(GND) D905.2(GND) J900.4(GND_L) J900.8(GND_U) J900.9(SHELL) J900.10(SHELL) J900.11(SHELL) J900.12(SHELL) R904.2 R905.2 R906.2 R907.2 R912.2 R913.2 U900.27(GND) U900.29(EP_GND) U901.2(GND) U902.2(GND) Y900.2(GND) Y900.4(GND)
VBUS_USBC: R902.1
VCC_3V3_SYS: C900.1 C901.1 C902.1 C903.1 C904.1 R908.1 R909.1 U900.18(OVCUR4#) U900.19(OVCUR3#) U900.26(V5) U900.28(VDD33)
VCC_5V0: C905.1 C906.1 C909.1 C910.1 R910.1 U901.5(IN) U902.5(IN)
HUB_P1_DM: L901.4(B4) U900.6(DM1)
HUB_P1_DP: L901.1(A1) U900.7(DP1)
HUB_P2_DM: L902.4(B4) U900.8(DM2)
HUB_P2_DP: L902.1(A1) U900.9(DP2)
HUB_PGANG: R907.1 U900.3(LED2/PGANG)
HUB_RESET_N: D902.1(A) U900.17(RESET#/CDP)
HUB_XI: U900.11(XI) Y900.1(X1)
HUB_XO: U900.12(XO) Y900.3(X2)
USB0_DM: L900.3(B3)
USB0_DP: L900.2(A2)
USB0_DRVVBUS: R905.1
USB0_VBUS_CLAMP: D901.3(K) R902.2 R903.1
USB0_VBUS_DIV: R903.2 R904.1
USB1_DM: U900.20(DMU)
USB1_DP: U900.21(DPU)
USB1_DRVVBUS: R913.1 U901.4(EN) U902.4(EN)
USB1_VBUS_CLAMP: D903.3(K) R910.2 R911.1
USB1_VBUS_DIV: R911.2 R912.1
USB_HUB_RST_N: D902.2(K) R906.1
USBA1_DM: D904.3(I/O2) D904.4(I/O2) J900.2(D-_L) L901.3(B3)
USBA1_DP: D904.1(I/O1) D904.6(I/O1) J900.3(D+_L) L901.2(A2)
USBA1_OC_N: R908.2 U900.24(OVCUR1#) U901.3(~{OC})
USBA2_DM: D905.3(I/O2) D905.4(I/O2) J900.6(D-_U) L902.3(B3)
USBA2_DP: D905.1(I/O1) D905.6(I/O1) J900.7(D+_U) L902.2(A2)
USBA2_OC_N: R909.2 U900.23(OVCUR2#) U902.3(~{OC})
USBC1_DM: D900.3(IO2) L900.4(B4)
USBC1_DP: D900.2(IO1) L900.1(A1)
VBUS_USBA1: C907.1 C908.1 D904.5(VBUS) J900.1(VBUS_L) U901.1(OUT)
VBUS_USBA2: C911.1 C912.1 D905.5(VBUS) J900.5(VBUS_U) U902.1(OUT)

Not connected (* = marked no-connect by the designer): D901 2(NC)*; D903 2(NC)*; U900 1(LED1/PSELF)* 2(PWREN2#)* 4(PWREN1#)* 5(PWREN4#/SUSP)* 10(PWREN3#)* 13(DM3)* 14(DP3)* 15(DM4)* 16(DP4)* 22(LED3/SCL)* 25(LED4/SDA)*

### Notes on the sheet
- * USB0 - device / DFU port on USB-C #1 (connector on sheet 01)
- * USB1 host -> CH335F 4-port MTT hub (self-powered, ports 1-2 used)
- * USB-A ports: 0.5 A each, enabled together by USB1_DRVVBUS, OC flags to the hub
- (near D900) * Order from the USB-C pads: ESD122 -> CMC L900 -> SoC (no 0R bypass: dropped 2026-11-10).
- * 90 Ohm diff, no other series parts on USB0_DP/DM (AM62x / Octavo checklist).
- (near U900) * PSELF floats high (internal pull-up) = self-powered. LED3/LED4 float (no EEPROM, no LEDs).
- * PWREN1..4# unused (port power follows USB1_DRVVBUS). Ports 3/4: DP/DM open, OVCUR3/4# tied high.
- * No load caps on Y900: XI/XO have ~16 pF built in (WCH DS 6.1).
- * VBUS_USBC is 5-9 V (PD max 9 V). Pin = VBUS x 10/29.98 unclamped:
- (near L901) * Reset low = 0.25 V + 115 uA x 1.5k = 0.42 V < VILRST 0.75 V. GPIO high: diode blocks,
- *   5 V -> 1.67 V, 9 V -> 3.00 V, 9.45 V (+5%) -> 3.15 V; all < 3.465 V ROC / 3.6 V abs max.
- *   Above ~7.9 V the zener node clamps at 6.4-7.2 V -> pin 2.4-2.7 V. At 9 V R902 sees 1.4 mW.
- (near L901) * RESET# rises on its own ~25k pull-up, so CDP is never strapped on (WCH Fig 3-2-2).
- * USB0_DRVVBUS: device-only port, pin left on its internal pull-down; R905 is the SK option.
- * V5 and VDD33 both on VCC_3V3_SYS (internal LDO bypassed, WCH DS 6.4).
- * USB1_VBUS_DIV = 1.67 V from VCC_5V0. In host mode the pin is optional (SK D-note);
- * DT: set ti,vbus-divider on both USB wrappers.
- * J900 pad numbers are defined by the symbol (the Bossie drawing has none):
- *   1-4 lower port VBUS/D-/D+/GND = port 1, 5-8 upper port = port 2, 9-12 shell pegs.
- * USBLC6 at the connector pins, then CMC L901/L902 (no 0R bypass).
- * Hub port k -> USB-A port k. 90 Ohm diff; keep DP/DM pairs away from the 5 V switch nodes.
- (in symbol CAP_POL) +

### Library data of the parts
C900 = CAP: Capacitor, non-polarized; Spec: 1uF 10V X5R 0402 (V5 pin 26)
C901 = CAP: Capacitor, non-polarized; MPN: CL05B104KO5NNNC; Manufacturer: Samsung; Spec: 100nF 16V X7R 0402 (V5 pin 26); LCSC: C1525
C902 = CAP: Capacitor, non-polarized; Spec: 10uF 10V X5R 0603 (VDD33 pin 28)
C903 = CAP: Capacitor, non-polarized; Spec: 1uF 10V X5R 0402 (VDD33 pin 28)
C904 = CAP: Capacitor, non-polarized; MPN: CL05B104KO5NNNC; Manufacturer: Samsung; Spec: 100nF 16V X7R 0402 (VDD33 pin 28); LCSC: C1525
C905 C909 = CAP: Capacitor, non-polarized; MPN: CL21A106KAYNNNE; Manufacturer: Samsung; Spec: 10uF 25V X5R 0805 (switch IN); LCSC: C15850
C906 C910 = CAP: Capacitor, non-polarized; MPN: CL05B104KO5NNNC; Manufacturer: Samsung; Spec: 100nF 16V X7R 0402 (switch IN); LCSC: C1525
C907 C911 = CAP_POL: Capacitor, polarized (pin 1 = +); MPN: RYHV10V150UF6*5; Manufacturer: Honor Elec; Spec: 150uF 10V polymer (USB 2.0 >= 120 uF); LCSC: C48970647
C908 C912 = CAP: Capacitor, non-polarized; MPN: CL05B104KO5NNNC; Manufacturer: Samsung; Spec: 100nF 16V X7R 0402 (at connector); LCSC: C1525
C913 = CAP: Capacitor, non-polarized; DNP: 1; Spec: 4.7nF 2kV X7R 1206 DNP (SK C372 option)
D900 = ESD122_DMX: ESD122 2-channel 0.2 pF bidirectional ESD diode, X2SON-3 (DMX); Manufacturer: Texas Instruments; MPN: ESD122DMXR; LCSC: C544474
D901 D903 = BZX84_SOT23: Zener diode SOT-23 (1 = anode, 2 = NC, 3 = cathode); Manufacturer: LRC; Spec: LBZX84C6V8LT1G 6.8V; MPN: LBZX84C6V8LT1G; LCSC: C12746
D902 = DIODE: Diode (pin 1 = anode); Manufacturer: Diodes Inc; Spec: BAT54WS-7-F (anode at hub); MPN: BAT54WS-7-F; LCSC: C124205
D904 D905 = USBLC6-2SC6: USBLC6-2 2-line USB ESD array with VBUS clamp, SOT23-6L; Manufacturer: STMicroelectronics; MPN: USBLC6-2SC6; LCSC: C7519
J900 = BX-TYPE-A-MWC44: Dual stacked USB 2.0 Type-A receptacle, THT right angle (Bossie BX-TYPE-A-MWC44); Manufacturer: Wurth Elektronik; MPN: 61400826021; Supplier: Mouser 710-61400826021
L900-L902 = SDCW2012-2: Sunlord SDCW2012-2 wire-wound 2-line common-mode choke, 0805; Spec: SDCW2012-2-900TF 90R@100MHz; MPN: SDCW2012-2-900TF; Manufacturer: Sunlord; LCSC: C54888
R902 R910 = RES: Resistor; Spec: 3.48k 1% 0402
R903 R911 = RES: Resistor; Spec: 16.5k 1% 0402
R904 R912 = RES: Resistor; Spec: 10k 1% 0402
R905 = RES: Resistor; DNP: 1; Spec: 10k 0402 DNP (device-only port)
R906 = RES: Resistor; Spec: 1.5k 0402 (holds hub in reset while SoC pads are off)
R907 = RES: Resistor; Spec: 3.9k 0402 (PGANG low = independent OC)
R908 R909 = RES: Resistor; Spec: 10k 0402 (TPS2051B OC pull-up)
R913 = RES: Resistor; Spec: 100k 0402 (keeps USB-A power off while the SoC IO is unpowered; DNP only for USB1 deep-sleep wake)
U900 = CH335F: WCH CH335F USB 2.0 HS 4-port MTT hub, per-port power/OC, QFN-28 4x4; Manufacturer: WCH (Jiangsu Qin Heng); MPN: CH335F; LCSC: C5137013
U901 U902 = TPS2051B_DBV: TPS2051B 0.5 A USB power switch, active-high EN, OC flag, SOT-23-5; Manufacturer: Texas Instruments; MPN: TPS2051BDBVR; LCSC: C24593
Y900 = XTAL_YSX321SL: Crystal 3.2x2.5 mm 4-pad, YXC YSX321SL (1/3 crystal, 2/4 GND); Manufacturer: Diodes Incorporated; Spec: FL1200074 12MHz 20pF 20ppm; MPN: FL1200074; Supplier: Digi-Key FL1200074

## Sheet 10_HDMI.SchDoc
size 812 x 508 mm; SheetNumber: 10; SheetTotal: 16
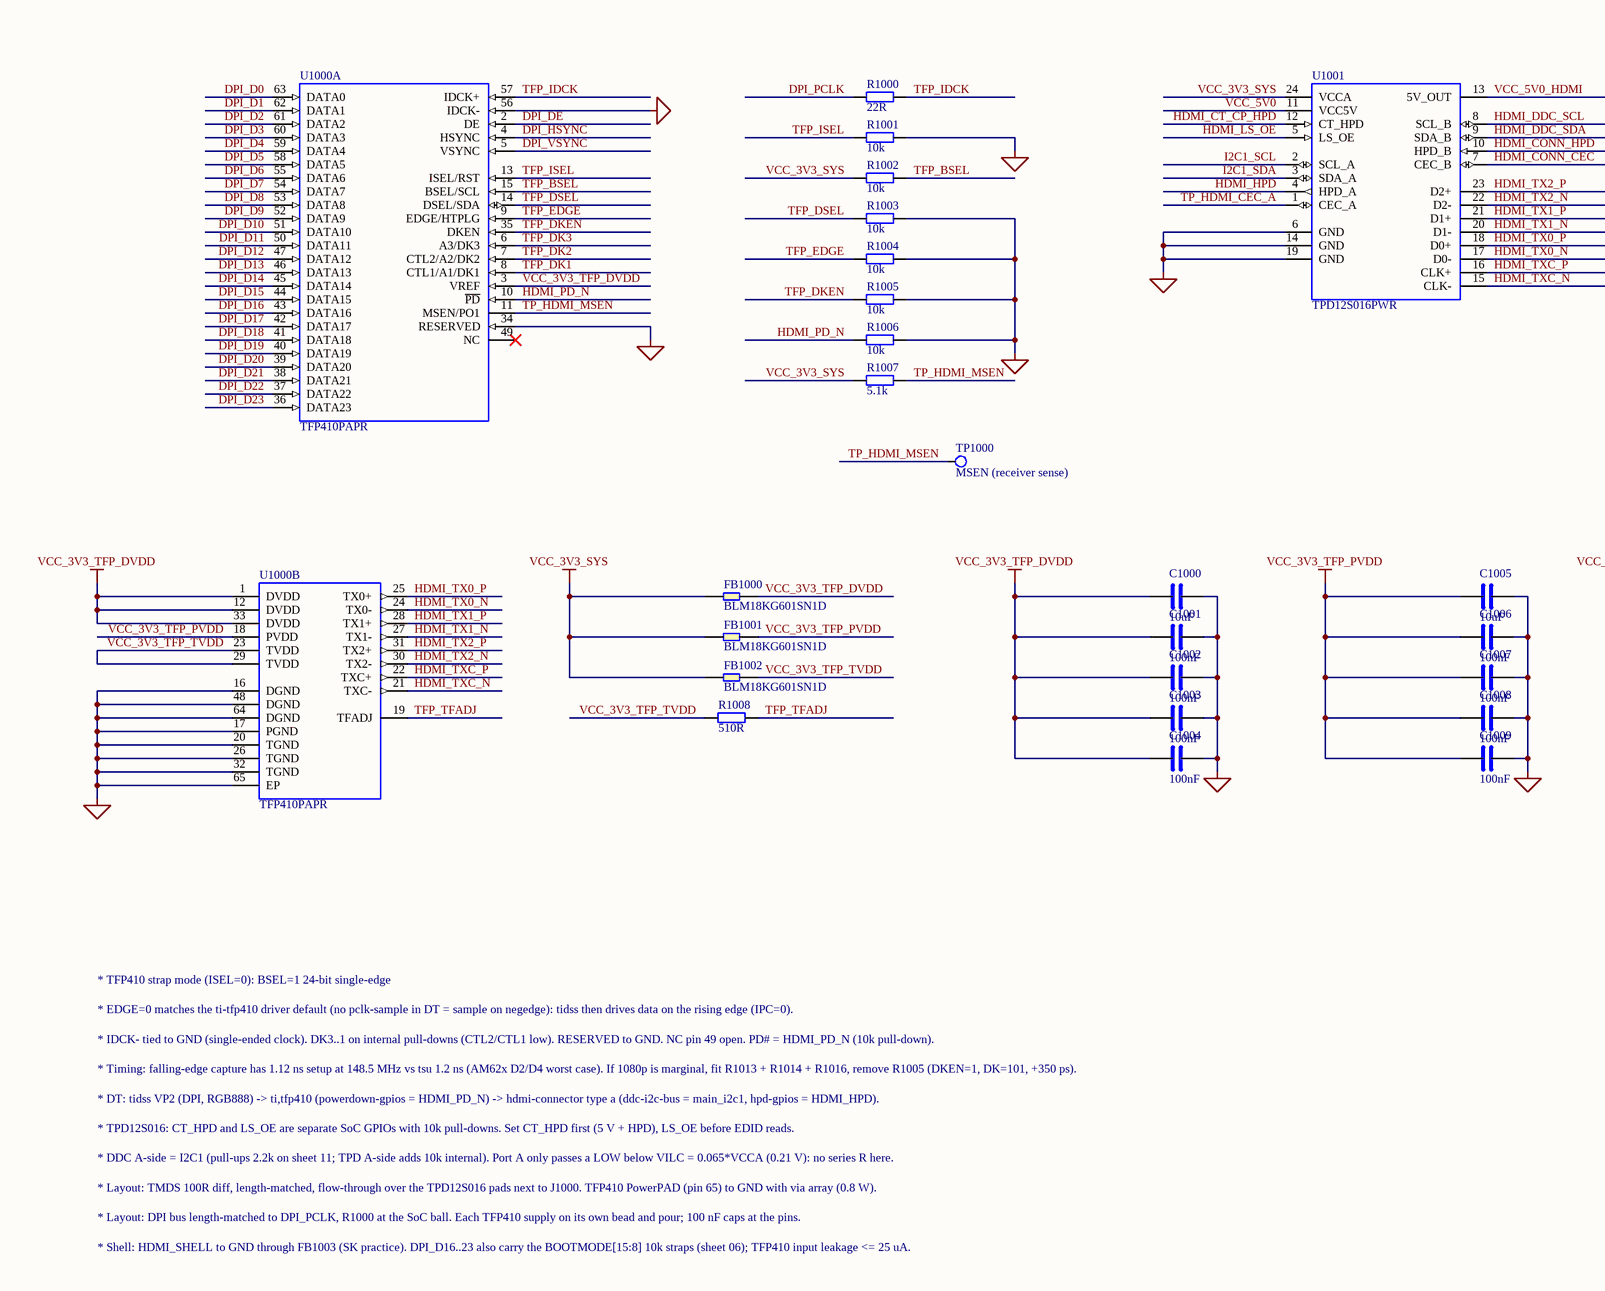
[diagram p13: 10_HDMI.SchDoc, left]
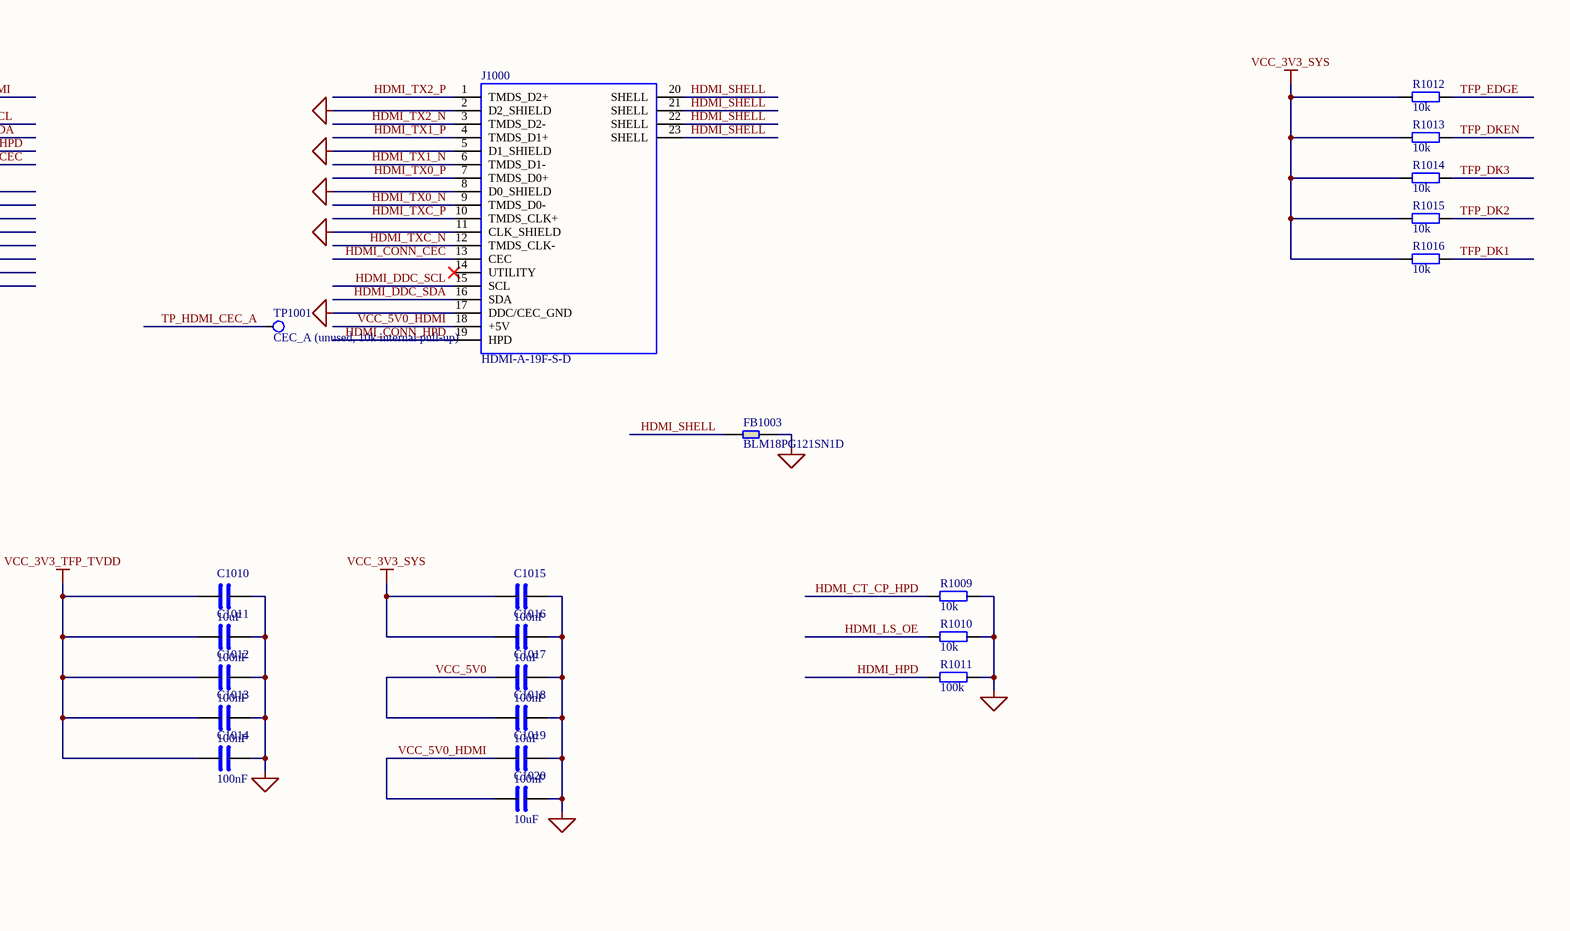
[diagram p14: 10_HDMI.SchDoc, right]

### Parts
C1000  10uF  [C0603]
C1001  100nF  [C0402]
C1002  100nF  [C0402]
C1003  100nF  [C0402]
C1004  100nF  [C0402]
C1005  10uF  [C0603]
C1006  100nF  [C0402]
C1007  100nF  [C0402]
C1008  100nF  [C0402]
C1009  100nF  [C0402]
C1010  10uF  [C0603]
C1011  100nF  [C0402]
C1012  100nF  [C0402]
C1013  100nF  [C0402]
C1014  100nF  [C0402]
C1015  100nF  [C0402]
C1016  10uF  [C0603]
C1017  100nF  [C0402]
C1018  10uF  [C0603]
C1019  100nF  [C0402]
C1020  10uF  [C0603]
FB1000  BLM18KG601SN1D  [FB0603]
FB1001  BLM18KG601SN1D  [FB0603]
FB1002  BLM18KG601SN1D  [FB0603]
FB1003  BLM18PG121SN1D  [FB0603]
J1000  HDMI-A-19F-S-D  [HDMI_A_XFCN_19F_S_D]
R1000  22R  [R0402]
R1001  10k  [R0402]
R1002  10k  [R0402]
R1003  10k  [R0402]
R1004  10k  [R0402]
R1005  10k  [R0402]
R1006  10k  [R0402]
R1007  5.1k  [R0402]
R1008  510R  [R0402]
R1009  10k  [R0402]
R1010  10k  [R0402]
R1011  100k  [R0402]
R1012  10k  [R0402]
R1013  10k  [R0402]
R1014  10k  [R0402]
R1015  10k  [R0402]
R1016  10k  [R0402]
TP1000  MSEN (receiver sense)  [TP_PAD_1.0]
TP1001  CEC_A (unused, 10k internal pull-up)  [TP_PAD_1.0]
U1000  TFP410PAPR  [HTQFP64_PAP_10X10]  (parts A,B of 2)
U1001  TPD12S016PWR  [TSSOP24_4.4X7.8_P0.65]

### Nets
GND: C1000.2 C1001.2 C1002.2 C1003.2 C1004.2 C1005.2 C1006.2 C1007.2 C1008.2 C1009.2 C1010.2 C1011.2 C1012.2 C1013.2 C1014.2 C1015.2 C1016.2 C1017.2 C1018.2 C1019.2 C1020.2 FB1003.2 J1000.2(D2_SHIELD) J1000.5(D1_SHIELD) J1000.8(D0_SHIELD) J1000.11(CLK_SHIELD) J1000.17(DDC/CEC_GND) R1001.2 R1003.2 R1004.2 R1005.2 R1006.2 R1009.2 R1010.2 R1011.2 U1000.16(DGND) U1000.17(PGND) U1000.20(TGND) U1000.26(TGND) U1000.32(TGND) U1000.34(RESERVED) U1000.48(DGND) U1000.56(IDCK-) U1000.64(DGND) U1000.65(EP) U1001.6(GND) U1001.14(GND) U1001.19(GND)
VCC_3V3_SYS: C1015.1 C1016.1 FB1000.1 FB1001.1 FB1002.1 R1002.1 R1007.1 R1012.1 R1013.1 R1014.1 R1015.1 R1016.1 U1001.24(VCCA)
VCC_3V3_TFP_DVDD: C1000.1 C1001.1 C1002.1 C1003.1 C1004.1 FB1000.2 U1000.1(DVDD) U1000.3(VREF) U1000.12(DVDD) U1000.33(DVDD)
VCC_3V3_TFP_PVDD: C1005.1 C1006.1 C1007.1 C1008.1 C1009.1 FB1001.2 U1000.18(PVDD)
VCC_3V3_TFP_TVDD: C1010.1 C1011.1 C1012.1 C1013.1 C1014.1 FB1002.2 R1008.1 U1000.23(TVDD) U1000.29(TVDD)
VCC_5V0: C1017.1 C1018.1 U1001.11(VCC5V)
DPI_D0: U1000.63(DATA0)
DPI_D1: U1000.62(DATA1)
DPI_D2: U1000.61(DATA2)
DPI_D3: U1000.60(DATA3)
DPI_D4: U1000.59(DATA4)
DPI_D5: U1000.58(DATA5)
DPI_D6: U1000.55(DATA6)
DPI_D7: U1000.54(DATA7)
DPI_D8: U1000.53(DATA8)
DPI_D9: U1000.52(DATA9)
DPI_D10: U1000.51(DATA10)
DPI_D11: U1000.50(DATA11)
DPI_D12: U1000.47(DATA12)
DPI_D13: U1000.46(DATA13)
DPI_D14: U1000.45(DATA14)
DPI_D15: U1000.44(DATA15)
DPI_D16: U1000.43(DATA16)
DPI_D17: U1000.42(DATA17)
DPI_D18: U1000.41(DATA18)
DPI_D19: U1000.40(DATA19)
DPI_D20: U1000.39(DATA20)
DPI_D21: U1000.38(DATA21)
DPI_D22: U1000.37(DATA22)
DPI_D23: U1000.36(DATA23)
DPI_DE: U1000.2(DE)
DPI_HSYNC: U1000.4(HSYNC)
DPI_PCLK: R1000.1
DPI_VSYNC: U1000.5(VSYNC)
HDMI_CONN_CEC: J1000.13(CEC) U1001.7(CEC_B)
HDMI_CONN_HPD: J1000.19(HPD) U1001.10(HPD_B)
HDMI_CT_CP_HPD: R1009.1 U1001.12(CT_HPD)
HDMI_DDC_SCL: J1000.15(SCL) U1001.8(SCL_B)
HDMI_DDC_SDA: J1000.16(SDA) U1001.9(SDA_B)
HDMI_HPD: R1011.1 U1001.4(HPD_A)
HDMI_LS_OE: R1010.1 U1001.5(LS_OE)
HDMI_PD_N: R1006.1 U1000.10(~{PD})
HDMI_SHELL: FB1003.1 J1000.20(SHELL) J1000.21(SHELL) J1000.22(SHELL) J1000.23(SHELL)
HDMI_TX0_N: J1000.9(TMDS_D0-) U1000.24(TX0-) U1001.17(D0-)
HDMI_TX0_P: J1000.7(TMDS_D0+) U1000.25(TX0+) U1001.18(D0+)
HDMI_TX1_N: J1000.6(TMDS_D1-) U1000.27(TX1-) U1001.20(D1-)
HDMI_TX1_P: J1000.4(TMDS_D1+) U1000.28(TX1+) U1001.21(D1+)
HDMI_TX2_N: J1000.3(TMDS_D2-) U1000.30(TX2-) U1001.22(D2-)
HDMI_TX2_P: J1000.1(TMDS_D2+) U1000.31(TX2+) U1001.23(D2+)
HDMI_TXC_N: J1000.12(TMDS_CLK-) U1000.21(TXC-) U1001.15(CLK-)
HDMI_TXC_P: J1000.10(TMDS_CLK+) U1000.22(TXC+) U1001.16(CLK+)
I2C1_SCL: U1001.2(SCL_A)
I2C1_SDA: U1001.3(SDA_A)
TFP_BSEL: R1002.2 U1000.15(BSEL/SCL)
TFP_DK1: R1016.2 U1000.8(CTL1/A1/DK1)
TFP_DK2: R1015.2 U1000.7(CTL2/A2/DK2)
TFP_DK3: R1014.2 U1000.6(A3/DK3)
TFP_DKEN: R1005.1 R1013.2 U1000.35(DKEN)
TFP_DSEL: R1003.1 U1000.14(DSEL/SDA)
TFP_EDGE: R1004.1 R1012.2 U1000.9(EDGE/HTPLG)
TFP_IDCK: R1000.2 U1000.57(IDCK+)
TFP_ISEL: R1001.1 U1000.13(ISEL/RST)
TFP_TFADJ: R1008.2 U1000.19(TFADJ)
TP_HDMI_CEC_A: TP1001.1(TP) U1001.1(CEC_A)
TP_HDMI_MSEN: R1007.2 TP1000.1(TP) U1000.11(MSEN/PO1)
VCC_5V0_HDMI: C1019.1 C1020.1 J1000.18(+5V) U1001.13(5V_OUT)

Not connected (* = marked no-connect by the designer): J1000 14(UTILITY)*; U1000 49(NC)*

### Notes on the sheet
- * TFP410 strap mode (ISEL=0): BSEL=1 24-bit single-edge
- * EDGE=0 matches the ti-tfp410 driver default (no pclk-sample in DT = sample on negedge): tidss then drives data on the rising edge (IPC=0).
- * IDCK- tied to GND (single-ended clock). DK3..1 on internal pull-downs (CTL2/CTL1 low). RESERVED to GND. NC pin 49 open. PD# = HDMI_PD_N (10k pull-down).
- * Timing: falling-edge capture has 1.12 ns setup at 148.5 MHz vs tsu 1.2 ns (AM62x D2/D4 worst case). If 1080p is marginal, fit R1013 + R1014 + R1016, remove R1005 (DKEN=1, DK=101, +350 ps).
- * DT: tidss VP2 (DPI, RGB888) -> ti,tfp410 (powerdown-gpios = HDMI_PD_N) -> hdmi-connector type a (ddc-i2c-bus = main_i2c1, hpd-gpios = HDMI_HPD).
- * TPD12S016: CT_HPD and LS_OE are separate SoC GPIOs with 10k pull-downs. Set CT_HPD first (5 V + HPD), LS_OE before EDID reads.
- * DDC A-side = I2C1 (pull-ups 2.2k on sheet 11; TPD A-side adds 10k internal). Port A only passes a LOW below VILC = 0.065*VCCA (0.21 V): no series R here.
- * Layout: TMDS 100R diff, length-matched, flow-through over the TPD12S016 pads next to J1000. TFP410 PowerPAD (pin 65) to GND with via array (0.8 W).
- * Layout: DPI bus length-matched to DPI_PCLK, R1000 at the SoC ball. Each TFP410 supply on its own bead and pour; 100 nF caps at the pins.
- * Shell: HDMI_SHELL to GND through FB1003 (SK practice). DPI_D16..23 also carry the BOOTMODE[15:8] 10k straps (sheet 06); TFP410 input leakage <= 25 uA.

### Library data of the parts
C1000 = CAP: Capacitor, non-polarized; Spec: 10uF 10V X5R 0603 (DVDD pins 1/12/33)
C1001-C1004 = CAP: Capacitor, non-polarized; Spec: 100nF 16V X7R 0402 (DVDD pins 1/12/33)
C1005 = CAP: Capacitor, non-polarized; Spec: 10uF 10V X5R 0603 (PVDD pin 18)
C1006-C1009 = CAP: Capacitor, non-polarized; Spec: 100nF 16V X7R 0402 (PVDD pin 18)
C1010 = CAP: Capacitor, non-polarized; Spec: 10uF 10V X5R 0603 (TVDD pins 23/29)
C1011-C1014 = CAP: Capacitor, non-polarized; Spec: 100nF 16V X7R 0402 (TVDD pins 23/29)
C1015 = CAP: Capacitor, non-polarized; Spec: 100nF 16V X7R 0402 (TPD VCCA)
C1016 = CAP: Capacitor, non-polarized; Spec: 10uF 10V X5R 0603 (TPD VCCA bulk, SK)
C1017 = CAP: Capacitor, non-polarized; Spec: 100nF 16V X7R 0402 (TPD VCC5V)
C1018 = CAP: Capacitor, non-polarized; Spec: 10uF 10V X5R 0603 (TPD VCC5V bulk, SK)
C1019 = CAP: Capacitor, non-polarized; Spec: 100nF 16V X7R 0402 (5V_OUT)
C1020 = CAP: Capacitor, non-polarized; Spec: 10uF 10V X5R 0603 (5V_OUT bulk, SK)
FB1000 = FERRITE: Ferrite bead; Manufacturer: Murata; Spec: BLM18KG601SN1D 600R@100MHz 1.3A 0603 (DVDD); MPN: BLM18KG601SN1D
FB1001 = FERRITE: Ferrite bead; Manufacturer: Murata; Spec: BLM18KG601SN1D 600R@100MHz 1.3A 0603 (PVDD); MPN: BLM18KG601SN1D
FB1002 = FERRITE: Ferrite bead; Manufacturer: Murata; Spec: BLM18KG601SN1D 600R@100MHz 1.3A 0603 (TVDD); MPN: BLM18KG601SN1D
FB1003 = FERRITE: Ferrite bead; Manufacturer: Murata; Spec: BLM18PG121SN1D 120R@100MHz 0603 (shell to GND, SK FL17); MPN: BLM18PG121SN1D
J1000 = HDMI_A_RECEPT: HDMI type-A receptacle, 19 pin + shell (XFCN HDMI-A-19F-S-D); MPN: HDMI-A-19F-S-D; Manufacturer: XFCN
R1000 = RES: Resistor; Spec: 22R 0402 (IDCK series, place at SoC ball T26)
R1001 = RES: Resistor; Spec: 10k 0402 (ISEL=0: I2C off, strap mode)
R1002 = RES: Resistor; Spec: 10k 0402 (BSEL=1: 24-bit single edge)
R1003 = RES: Resistor; Spec: 10k 0402 (DSEL=0: don't care at VREF=DVDD)
R1004 = RES: Resistor; Spec: 10k 0402 (EDGE=0: latch on IDCK falling edge)
R1005 = RES: Resistor; Spec: 10k 0402 (DKEN=0: de-skew off)
R1006 = RES: Resistor; Spec: 10k 0402 (TFP410 powered down in reset)
R1007 = RES: Resistor; Spec: 5.1k 0402 (MSEN open-drain pull-up, DS: 5k)
R1008 = RES: Resistor; Spec: 510R 1% 0402 (RTFADJ: 500 mV DVI swing)
R1009 = RES: Resistor; Spec: 10k 0402 (5 V switch + HPD off in reset)
R1010 = RES: Resistor; Spec: 10k 0402 (DDC level shifter off in reset)
R1011 = RES: Resistor; Spec: 100k 0402 (defines HPD while CT_HPD = 0)
R1012 = RES: Resistor; DNP: 1; Spec: 10k 0402 DNP (EDGE=1 option; remove R1004)
R1013 = RES: Resistor; DNP: 1; Spec: 10k 0402 DNP (DKEN=1 option; remove R1005)
R1014 = RES: Resistor; DNP: 1; Spec: 10k 0402 DNP (DK3=1)
R1015 = RES: Resistor; DNP: 1; Spec: 10k 0402 DNP (DK2=1)
R1016 = RES: Resistor; DNP: 1; Spec: 10k 0402 DNP (DK1=1)
TP1000 TP1001 = TESTPOINT: Test point
U1000 = TFP410_PAP: TI TFP410 DVI 1.0 transmitter, 24-bit DPI in, HTQFP-64 PowerPAD; Manufacturer: Texas Instruments; MPN: TFP410PAPR
U1001 = TPD12S016_PW: TI TPD12S016 HDMI companion: 5 V load switch, DDC/CEC/HPD level shift, 12-ch ESD, TSSOP-24; Manufacturer: Texas Instruments; MPN: TPD12S016PWR

## Sheet 11_Audio.SchDoc
size 508 x 381 mm; SheetNumber: 11; SheetTotal: 16
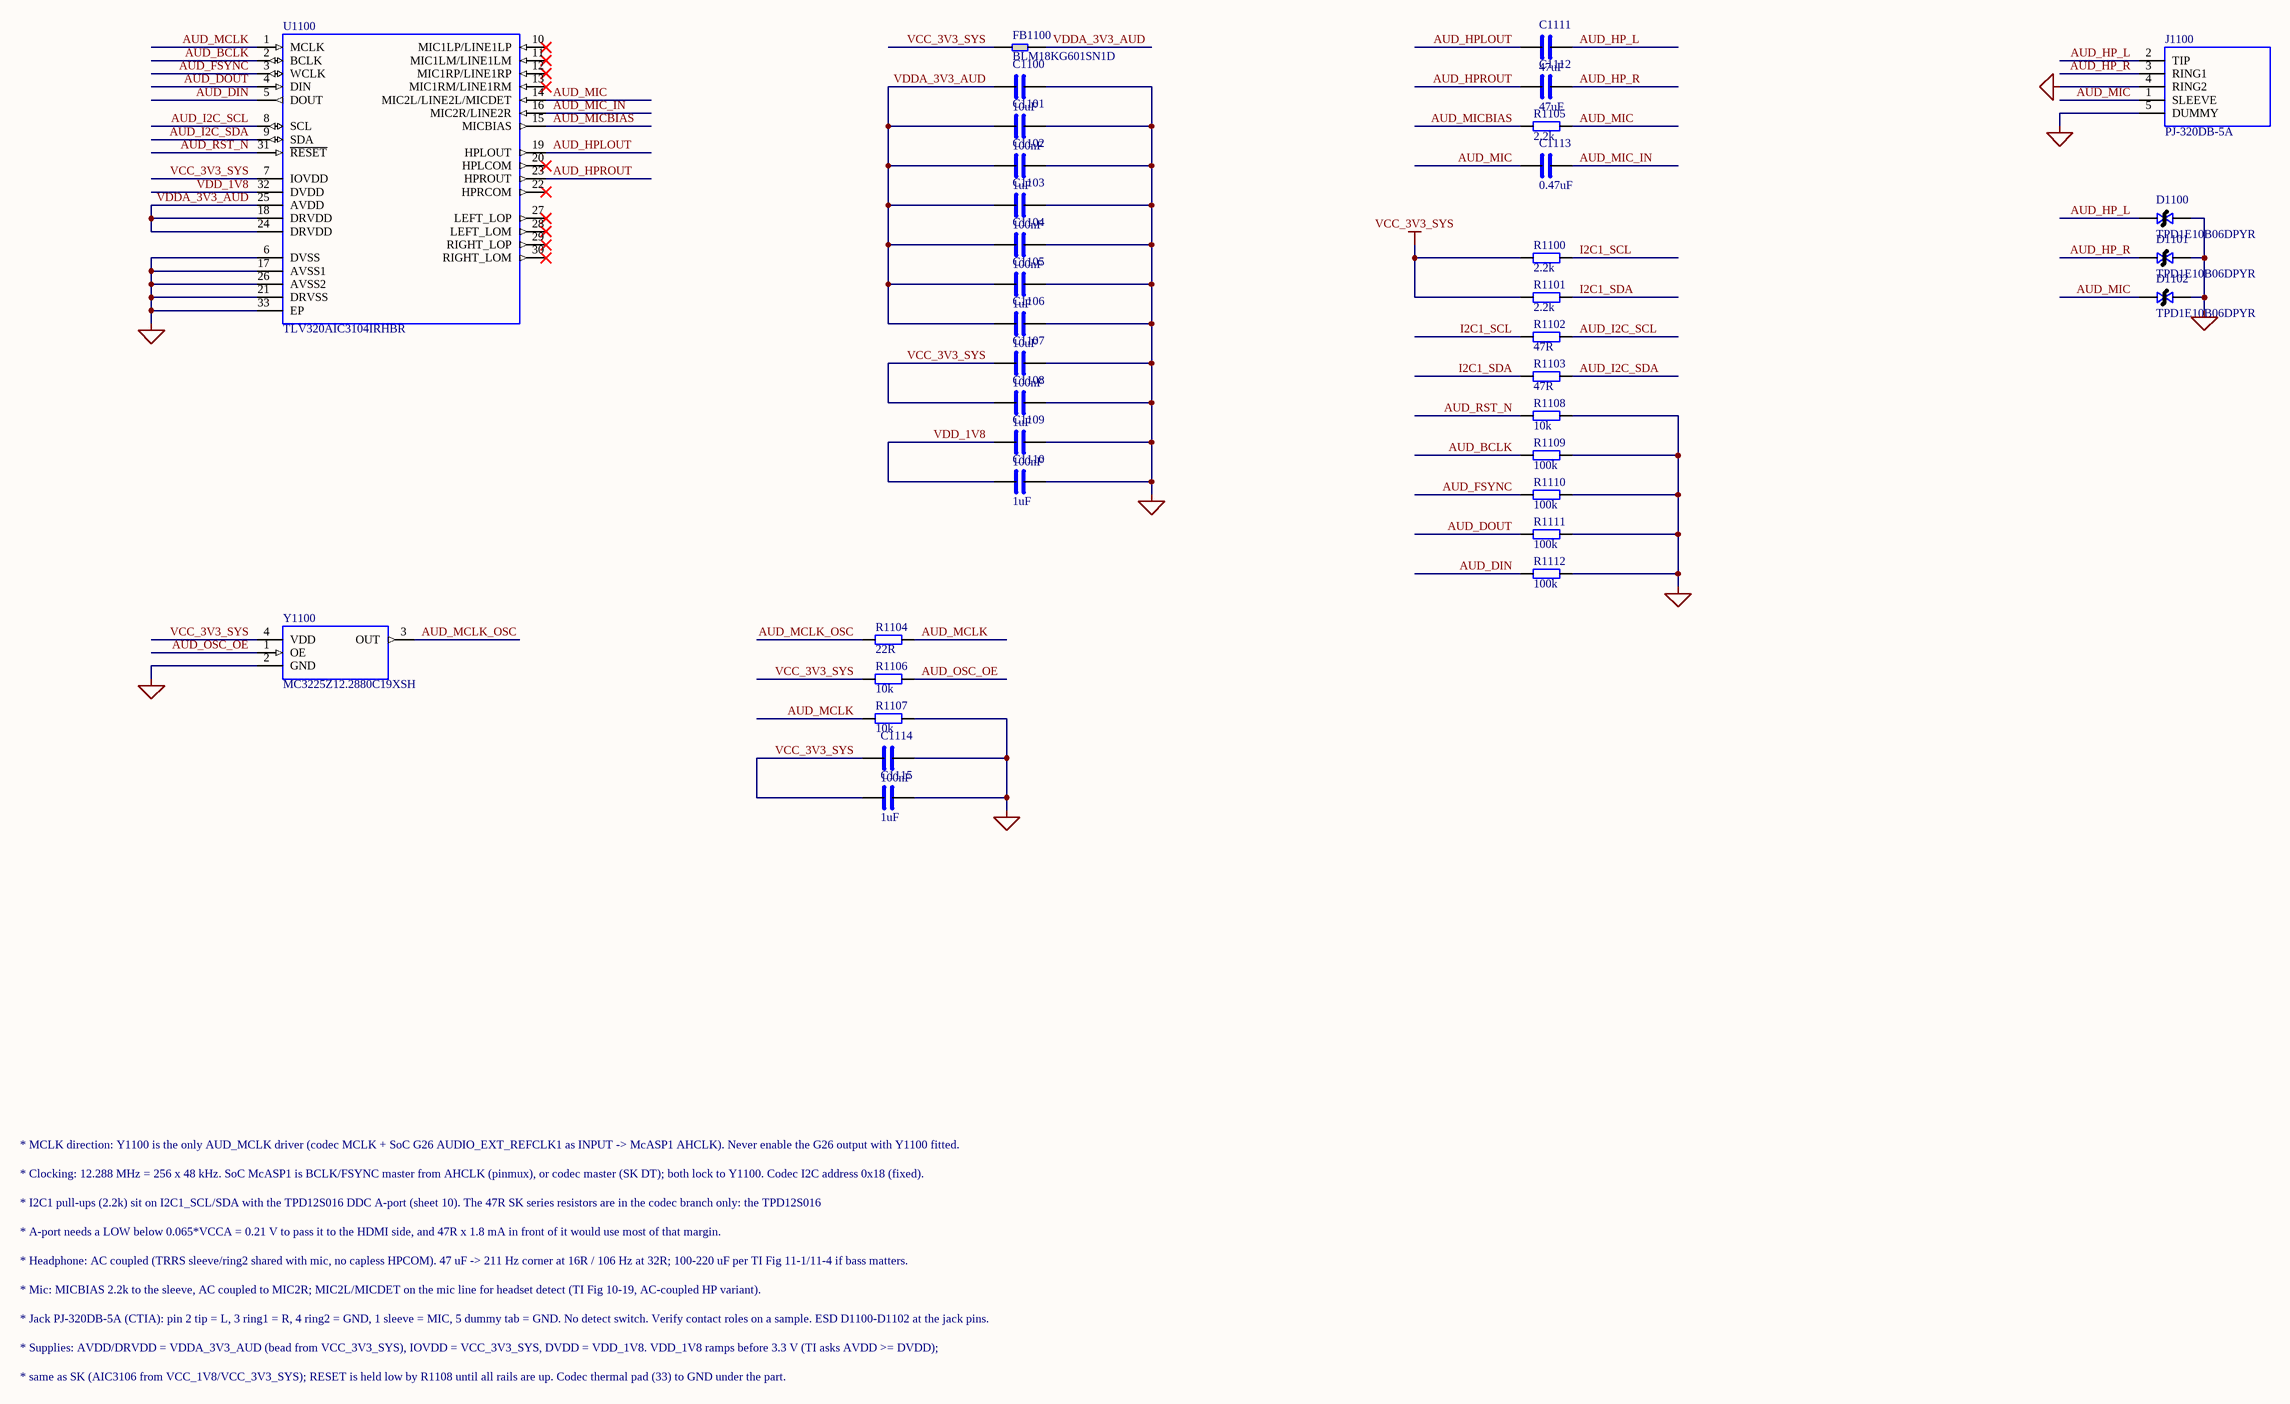
[diagram p15: 11_Audio.SchDoc]

### Parts
C1100  10uF  [C0603]
C1101  100nF  [C0402]
C1102  1uF  [C0402]
C1103  100nF  [C0402]
C1104  100nF  [C0402]
C1105  1uF  [C0402]
C1106  10uF  [C0603]
C1107  100nF  [C0402]
C1108  1uF  [C0402]
C1109  100nF  [C0402]
C1110  1uF  [C0402]
C1111  47uF  [C0805]
C1112  47uF  [C0805]
C1113  0.47uF  [C0402]
C1114  100nF  [C0402]
C1115  1uF  [C0402]
D1100  TPD1E10B06DPYR  [X1SON2_DPY]
D1101  TPD1E10B06DPYR  [X1SON2_DPY]
D1102  TPD1E10B06DPYR  [X1SON2_DPY]
FB1100  BLM18KG601SN1D  [FB0603]
J1100  PJ-320DB-5A  [JACK_HRO_PJ-320DB]
R1100  2.2k  [R0402]
R1101  2.2k  [R0402]
R1102  47R  [R0402]
R1103  47R  [R0402]
R1104  22R  [R0402]
R1105  2.2k  [R0402]
R1106  10k  [R0402]
R1107  10k  [R0402]
R1108  10k  [R0402]
R1109  100k  [R0402]
R1110  100k  [R0402]
R1111  100k  [R0402]
R1112  100k  [R0402]
U1100  TLV320AIC3104IRHBR  [VQFN32_RHB_5X5]
Y1100  MC3225Z12.2880C19XSH  [OSC_3225_4P]

### Nets
GND: C1100.2 C1101.2 C1102.2 C1103.2 C1104.2 C1105.2 C1106.2 C1107.2 C1108.2 C1109.2 C1110.2 C1114.2 C1115.2 D1100.2 D1101.2 D1102.2 J1100.4(RING2) J1100.5(DUMMY) R1107.2 R1108.2 R1109.2 R1110.2 R1111.2 R1112.2 U1100.6(DVSS) U1100.17(AVSS1) U1100.21(DRVSS) U1100.26(AVSS2) U1100.33(EP) Y1100.2(GND)
VCC_3V3_SYS: C1107.1 C1108.1 C1114.1 C1115.1 FB1100.1 R1100.1 R1101.1 R1106.1 U1100.7(IOVDD) Y1100.4(VDD)
VDD_1V8: C1109.1 C1110.1 U1100.32(DVDD)
AUD_BCLK: R1109.1 U1100.2(BCLK)
AUD_DIN: R1112.1 U1100.5(DOUT)
AUD_DOUT: R1111.1 U1100.4(DIN)
AUD_FSYNC: R1110.1 U1100.3(WCLK)
AUD_HP_L: C1111.2 D1100.1 J1100.2(TIP)
AUD_HP_R: C1112.2 D1101.1 J1100.3(RING1)
AUD_HPLOUT: C1111.1 U1100.19(HPLOUT)
AUD_HPROUT: C1112.1 U1100.23(HPROUT)
AUD_I2C_SCL: R1102.2 U1100.8(SCL)
AUD_I2C_SDA: R1103.2 U1100.9(SDA)
AUD_MCLK: R1104.2 R1107.1 U1100.1(MCLK)
AUD_MCLK_OSC: R1104.1 Y1100.3(OUT)
AUD_MIC: C1113.1 D1102.1 J1100.1(SLEEVE) R1105.2 U1100.14(MIC2L/LINE2L/MICDET)
AUD_MIC_IN: C1113.2 U1100.16(MIC2R/LINE2R)
AUD_MICBIAS: R1105.1 U1100.15(MICBIAS)
AUD_OSC_OE: R1106.2 Y1100.1(OE)
AUD_RST_N: R1108.1 U1100.31(~{RESET})
I2C1_SCL: R1100.2 R1102.1
I2C1_SDA: R1101.2 R1103.1
VDDA_3V3_AUD: C1100.1 C1101.1 C1102.1 C1103.1 C1104.1 C1105.1 C1106.1 FB1100.2 U1100.18(DRVDD) U1100.24(DRVDD) U1100.25(AVDD)

Not connected (* = marked no-connect by the designer): U1100 10(MIC1LP/LINE1LP)* 11(MIC1LM/LINE1LM)* 12(MIC1RP/LINE1RP)* 13(MIC1RM/LINE1RM)* 20(HPLCOM)* 22(HPRCOM)* 27(LEFT_LOP)* 28(LEFT_LOM)* 29(RIGHT_LOP)* 30(RIGHT_LOM)*

### Notes on the sheet
- * MCLK direction: Y1100 is the only AUD_MCLK driver (codec MCLK + SoC G26 AUDIO_EXT_REFCLK1 as INPUT -> McASP1 AHCLK). Never enable the G26 output with Y1100 fitted.
- * Clocking: 12.288 MHz = 256 x 48 kHz. SoC McASP1 is BCLK/FSYNC master from AHCLK (pinmux), or codec master (SK DT); both lock to Y1100. Codec I2C address 0x18 (fixed).
- * I2C1 pull-ups (2.2k) sit on I2C1_SCL/SDA with the TPD12S016 DDC A-port (sheet 10). The 47R SK series resistors are in the codec branch only: the TPD12S016
- * A-port needs a LOW below 0.065*VCCA = 0.21 V to pass it to the HDMI side, and 47R x 1.8 mA in front of it would use most of that margin.
- * Headphone: AC coupled (TRRS sleeve/ring2 shared with mic, no capless HPCOM). 47 uF -> 211 Hz corner at 16R / 106 Hz at 32R; 100-220 uF per TI Fig 11-1/11-4 if bass matters.
- * Mic: MICBIAS 2.2k to the sleeve, AC coupled to MIC2R; MIC2L/MICDET on the mic line for headset detect (TI Fig 10-19, AC-coupled HP variant).
- * Jack PJ-320DB-5A (CTIA): pin 2 tip = L, 3 ring1 = R, 4 ring2 = GND, 1 sleeve = MIC, 5 dummy tab = GND. No detect switch. Verify contact roles on a sample. ESD D1100-D1102 at the jack pins.
- * Supplies: AVDD/DRVDD = VDDA_3V3_AUD (bead from VCC_3V3_SYS), IOVDD = VCC_3V3_SYS, DVDD = VDD_1V8. VDD_1V8 ramps before 3.3 V (TI asks AVDD >= DVDD);
- * same as SK (AIC3106 from VCC_1V8/VCC_3V3_SYS); RESET is held low by R1108 until all rails are up. Codec thermal pad (33) to GND under the part.

### Library data of the parts
C1100 = CAP: Capacitor, non-polarized; Spec: 10uF 10V X5R 0603 (bulk after bead)
C1101 = CAP: Capacitor, non-polarized; Spec: 100nF 16V X7R 0402 (AVDD pin 25)
C1102 = CAP: Capacitor, non-polarized; Spec: 1uF 16V X5R 0402 (AVDD pin 25)
C1103 = CAP: Capacitor, non-polarized; Spec: 100nF 16V X7R 0402 (DRVDD pin 18)
C1104 = CAP: Capacitor, non-polarized; Spec: 100nF 16V X7R 0402 (DRVDD pin 24)
C1105 = CAP: Capacitor, non-polarized; Spec: 1uF 16V X5R 0402 (DRVDD)
C1106 = CAP: Capacitor, non-polarized; Spec: 10uF 10V X5R 0603 (DRVDD)
C1107 = CAP: Capacitor, non-polarized; Spec: 100nF 16V X7R 0402 (IOVDD pin 7)
C1108 = CAP: Capacitor, non-polarized; Spec: 1uF 16V X5R 0402 (IOVDD pin 7)
C1109 = CAP: Capacitor, non-polarized; Spec: 100nF 16V X7R 0402 (DVDD pin 32)
C1110 = CAP: Capacitor, non-polarized; Spec: 1uF 16V X5R 0402 (DVDD pin 32)
C1111 = CAP: Capacitor, non-polarized; Spec: 47uF 6.3V X5R 0805 (HP L coupling)
C1112 = CAP: Capacitor, non-polarized; Spec: 47uF 6.3V X5R 0805 (HP R coupling)
C1113 = CAP: Capacitor, non-polarized; Spec: 0.47uF 16V X7R 0402 (mic AC coupling)
C1114 = CAP: Capacitor, non-polarized; Spec: 100nF 16V X7R 0402 (Y1100 VDD)
C1115 = CAP: Capacitor, non-polarized; Spec: 1uF 16V X5R 0402 (Y1100 VDD)
D1100 = TVS_BI: Bidirectional TVS / ESD diode; Manufacturer: Texas Instruments; Spec: TPD1E10B06DPYR (tip, at J1100); MPN: TPD1E10B06DPYR
D1101 = TVS_BI: Bidirectional TVS / ESD diode; Manufacturer: Texas Instruments; Spec: TPD1E10B06DPYR (ring 1, at J1100); MPN: TPD1E10B06DPYR
D1102 = TVS_BI: Bidirectional TVS / ESD diode; Manufacturer: Texas Instruments; Spec: TPD1E10B06DPYR (sleeve, at J1100); MPN: TPD1E10B06DPYR
FB1100 = FERRITE: Ferrite bead; Manufacturer: Murata; Spec: BLM18KG601SN1D 600R@100MHz 1.3A 0603 (codec analog 3.3 V); MPN: BLM18KG601SN1D
J1100 = JACK_TRRS_PJ320DB: 3.5 mm TRRS jack, SMD, no switch (PJ-320DB-5A); Manufacturer: Korean Hroparts Elec; MPN: PJ-320DB-5A
R1100 R1101 = RES: Resistor; Spec: 2.2k 0402 (I2C1 pull-up)
R1102 = RES: Resistor; Spec: 47R 0402 (series, SK R759 practice)
R1103 = RES: Resistor; Spec: 47R 0402 (series, SK R760 practice)
R1104 = RES: Resistor; Spec: 22R 0402 (source series, at Y1100)
R1105 = RES: Resistor; Spec: 2.2k 0402 (MICBIAS feed)
R1106 = RES: Resistor; Spec: 10k 0402 (OE high = run, SK R425)
R1107 = RES: Resistor; Spec: 10k 0402 (MCLK pull-down, SK D-note)
R1108 = RES: Resistor; Spec: 10k 0402 (codec held in reset)
R1109-R1111 = RES: Resistor; Spec: 100k 0402 (pad off in SoC reset)
R1112 = RES: Resistor; Spec: 100k 0402 (codec DOUT Hi-Z in reset)
U1100 = TLV320AIC3104_RHB: TI TLV320AIC3104 low-power stereo codec, I2S + I2C, VQFN-32; Manufacturer: Texas Instruments; MPN: TLV320AIC3104IRHBR
Y1100 = OSC_3225_OE: LVCMOS oscillator with output enable, 3.2x2.5 mm 4-pad; Manufacturer: KYOCERA AVX; Spec: MC3225Z12.2880C19XSH 12.288MHz; MPN: MC3225Z12.2880C19XSH; Supplier: Digi-Key MC3225Z12.2880C19XSH

## Sheet 12_Camera.SchDoc
size 508 x 381 mm; SheetNumber: 12; SheetTotal: 16
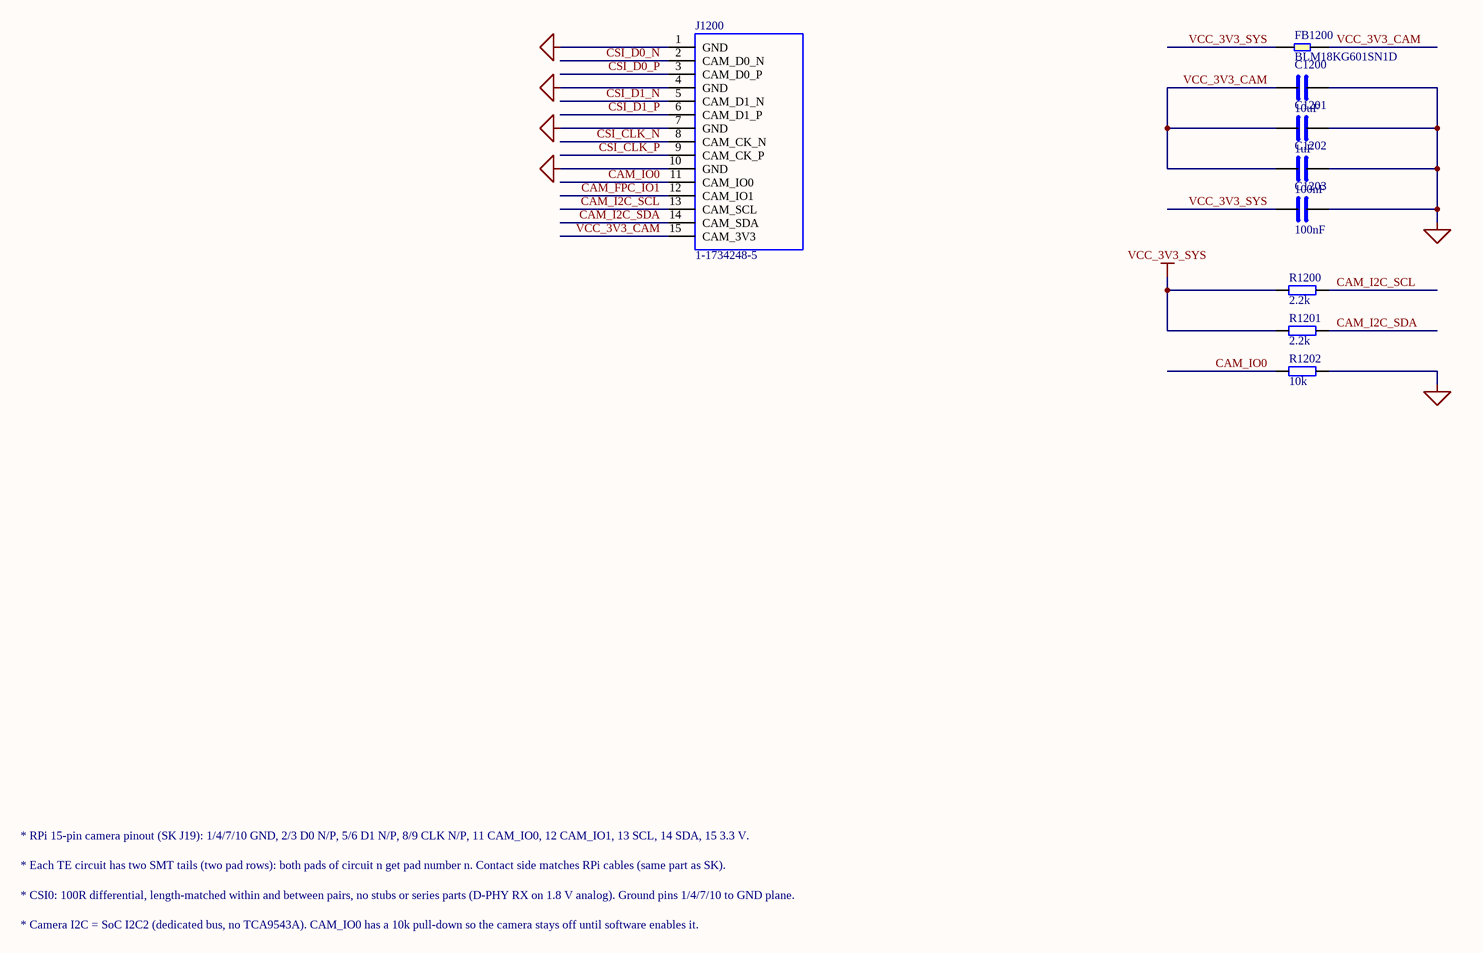
[diagram p16: 12_Camera.SchDoc]

### Parts
C1200  10uF  [C0603]
C1201  1uF  [C0402]
C1202  100nF  [C0402]
C1203  100nF  [C0402]
FB1200  BLM18KG601SN1D  [FB0603]
J1200  1-1734248-5  [FPC_TE_1-1734248-5]
R1200  2.2k  [R0402]
R1201  2.2k  [R0402]
R1202  10k  [R0402]

### Nets
GND: C1200.2 C1201.2 C1202.2 C1203.2 J1200.1(GND) J1200.4(GND) J1200.7(GND) J1200.10(GND) R1202.2
VCC_3V3_SYS: C1203.1 FB1200.1 R1200.1 R1201.1
CAM_FPC_IO1: J1200.12(CAM_IO1)
CAM_I2C_SCL: J1200.13(CAM_SCL) R1200.2
CAM_I2C_SDA: J1200.14(CAM_SDA) R1201.2
CAM_IO0: J1200.11(CAM_IO0) R1202.1
CSI_CLK_N: J1200.8(CAM_CK_N)
CSI_CLK_P: J1200.9(CAM_CK_P)
CSI_D0_N: J1200.2(CAM_D0_N)
CSI_D0_P: J1200.3(CAM_D0_P)
CSI_D1_N: J1200.5(CAM_D1_N)
CSI_D1_P: J1200.6(CAM_D1_P)
VCC_3V3_CAM: C1200.1 C1201.1 C1202.1 FB1200.2 J1200.15(CAM_3V3)

### Notes on the sheet
- * RPi 15-pin camera pinout (SK J19): 1/4/7/10 GND, 2/3 D0 N/P, 5/6 D1 N/P, 8/9 CLK N/P, 11 CAM_IO0, 12 CAM_IO1, 13 SCL, 14 SDA, 15 3.3 V.
- * Each TE circuit has two SMT tails (two pad rows): both pads of circuit n get pad number n. Contact side matches RPi cables (same part as SK).
- * CSI0: 100R differential, length-matched within and between pairs, no stubs or series parts (D-PHY RX on 1.8 V analog). Ground pins 1/4/7/10 to GND plane.
- * Camera I2C = SoC I2C2 (dedicated bus, no TCA9543A). CAM_IO0 has a 10k pull-down so the camera stays off until software enables it.

### Library data of the parts
C1200 = CAP: Capacitor, non-polarized; Spec: 10uF 10V X5R 0603 (bulk at J1200, SK C43)
C1201 = CAP: Capacitor, non-polarized; Spec: 1uF 16V X5R 0402
C1202 = CAP: Capacitor, non-polarized; Spec: 100nF 16V X7R 0402 (at pin 15, SK C45)
C1203 = CAP: Capacitor, non-polarized; Spec: 100nF 16V X7R 0402 (bead input)
FB1200 = FERRITE: Ferrite bead; Manufacturer: Murata; Spec: BLM18KG601SN1D 600R@100MHz 1.3A 0603 (camera 3.3 V); MPN: BLM18KG601SN1D
J1200 = FPC15_RPI_CSI: 15-pin 1.0 mm FPC, Raspberry Pi camera pinout (TE 1-1734248-5); Manufacturer: TE Connectivity; MPN: 1-1734248-5
R1200 R1201 = RES: Resistor; Spec: 2.2k 0402 (I2C2 pull-up)
R1202 = RES: Resistor; Spec: 10k 0402 (camera off in reset)